# EasyEDA Pro project ProPrj_CraftVia-Station-S-v1-Rev0_2026-09-30.epro, schematic Schematic1, sheets 1 to 6 of 7

## Sheets
1 01_PWR_MEAS: Board Name: Board1; Create Date: 2026-09-15; Page Name: P1; Project Name: CraftVia-Station-S-v1-Rev0; Schematic Name: Schematic1; Update Date: 2026-09-15; Company: CraftVia.org; Page Size: A4; Version: V1.0
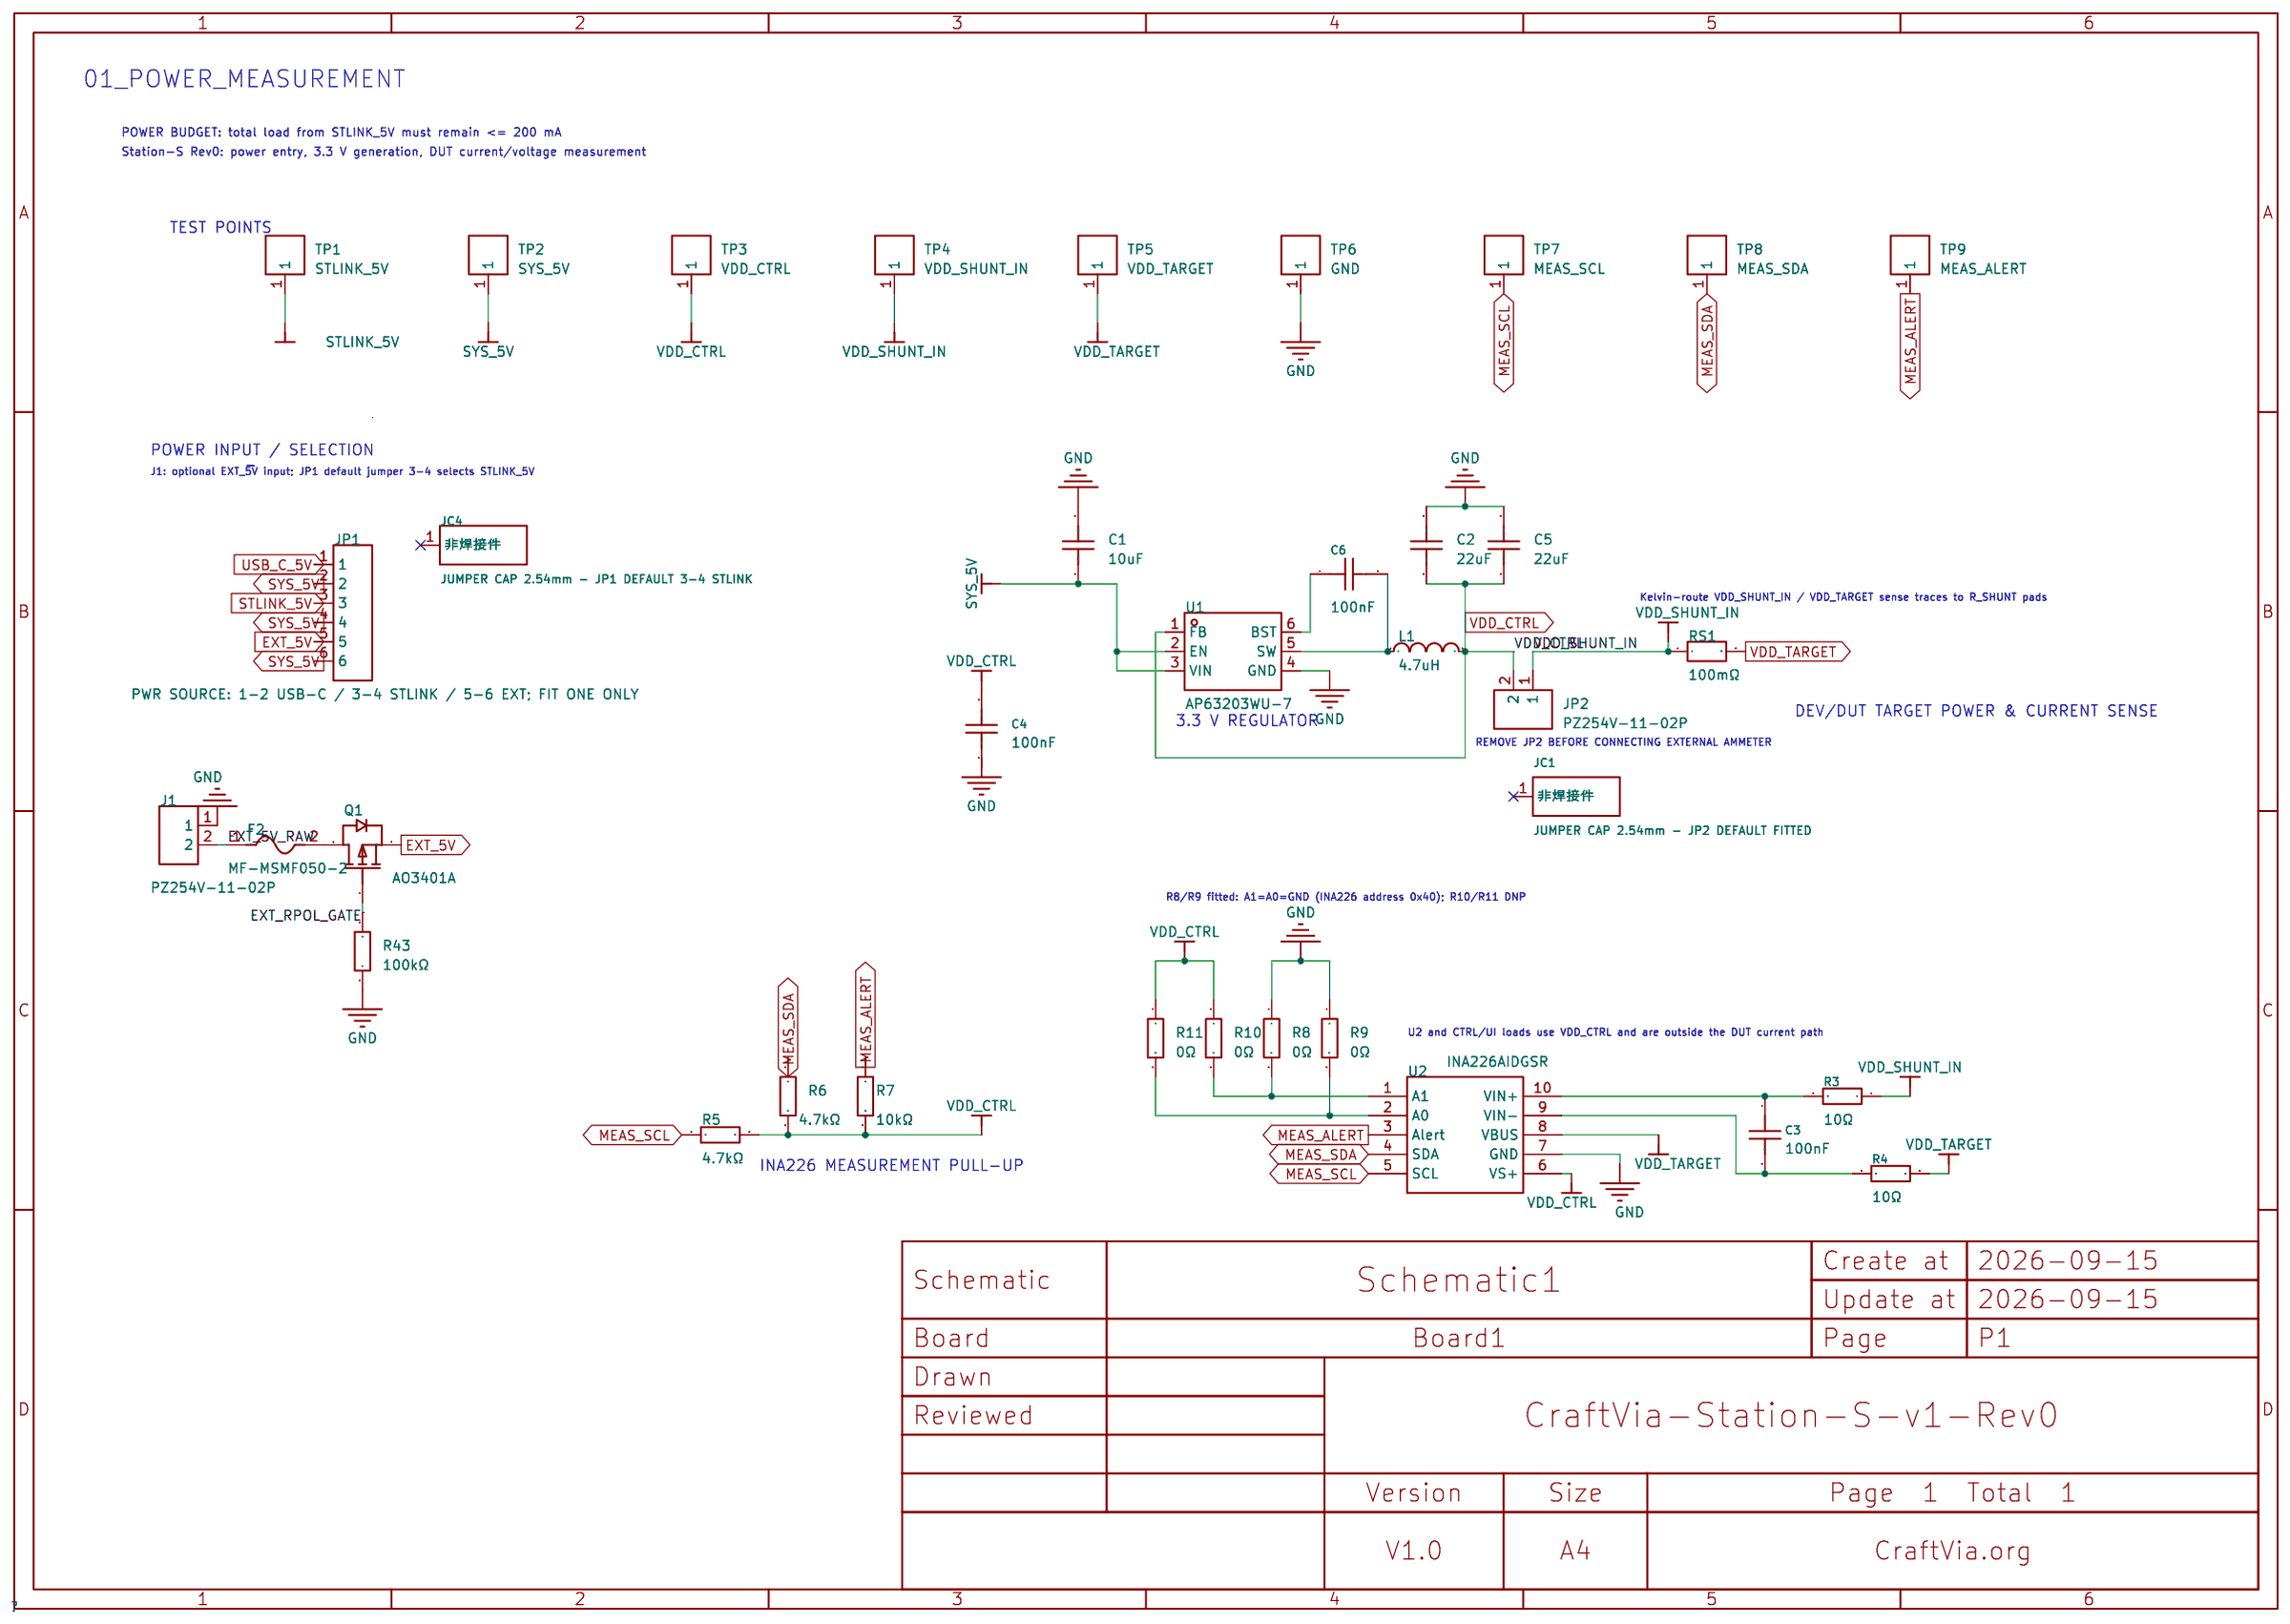
[diagram p0: 01_PWR_MEAS]
2 02_DEV_DEBUG
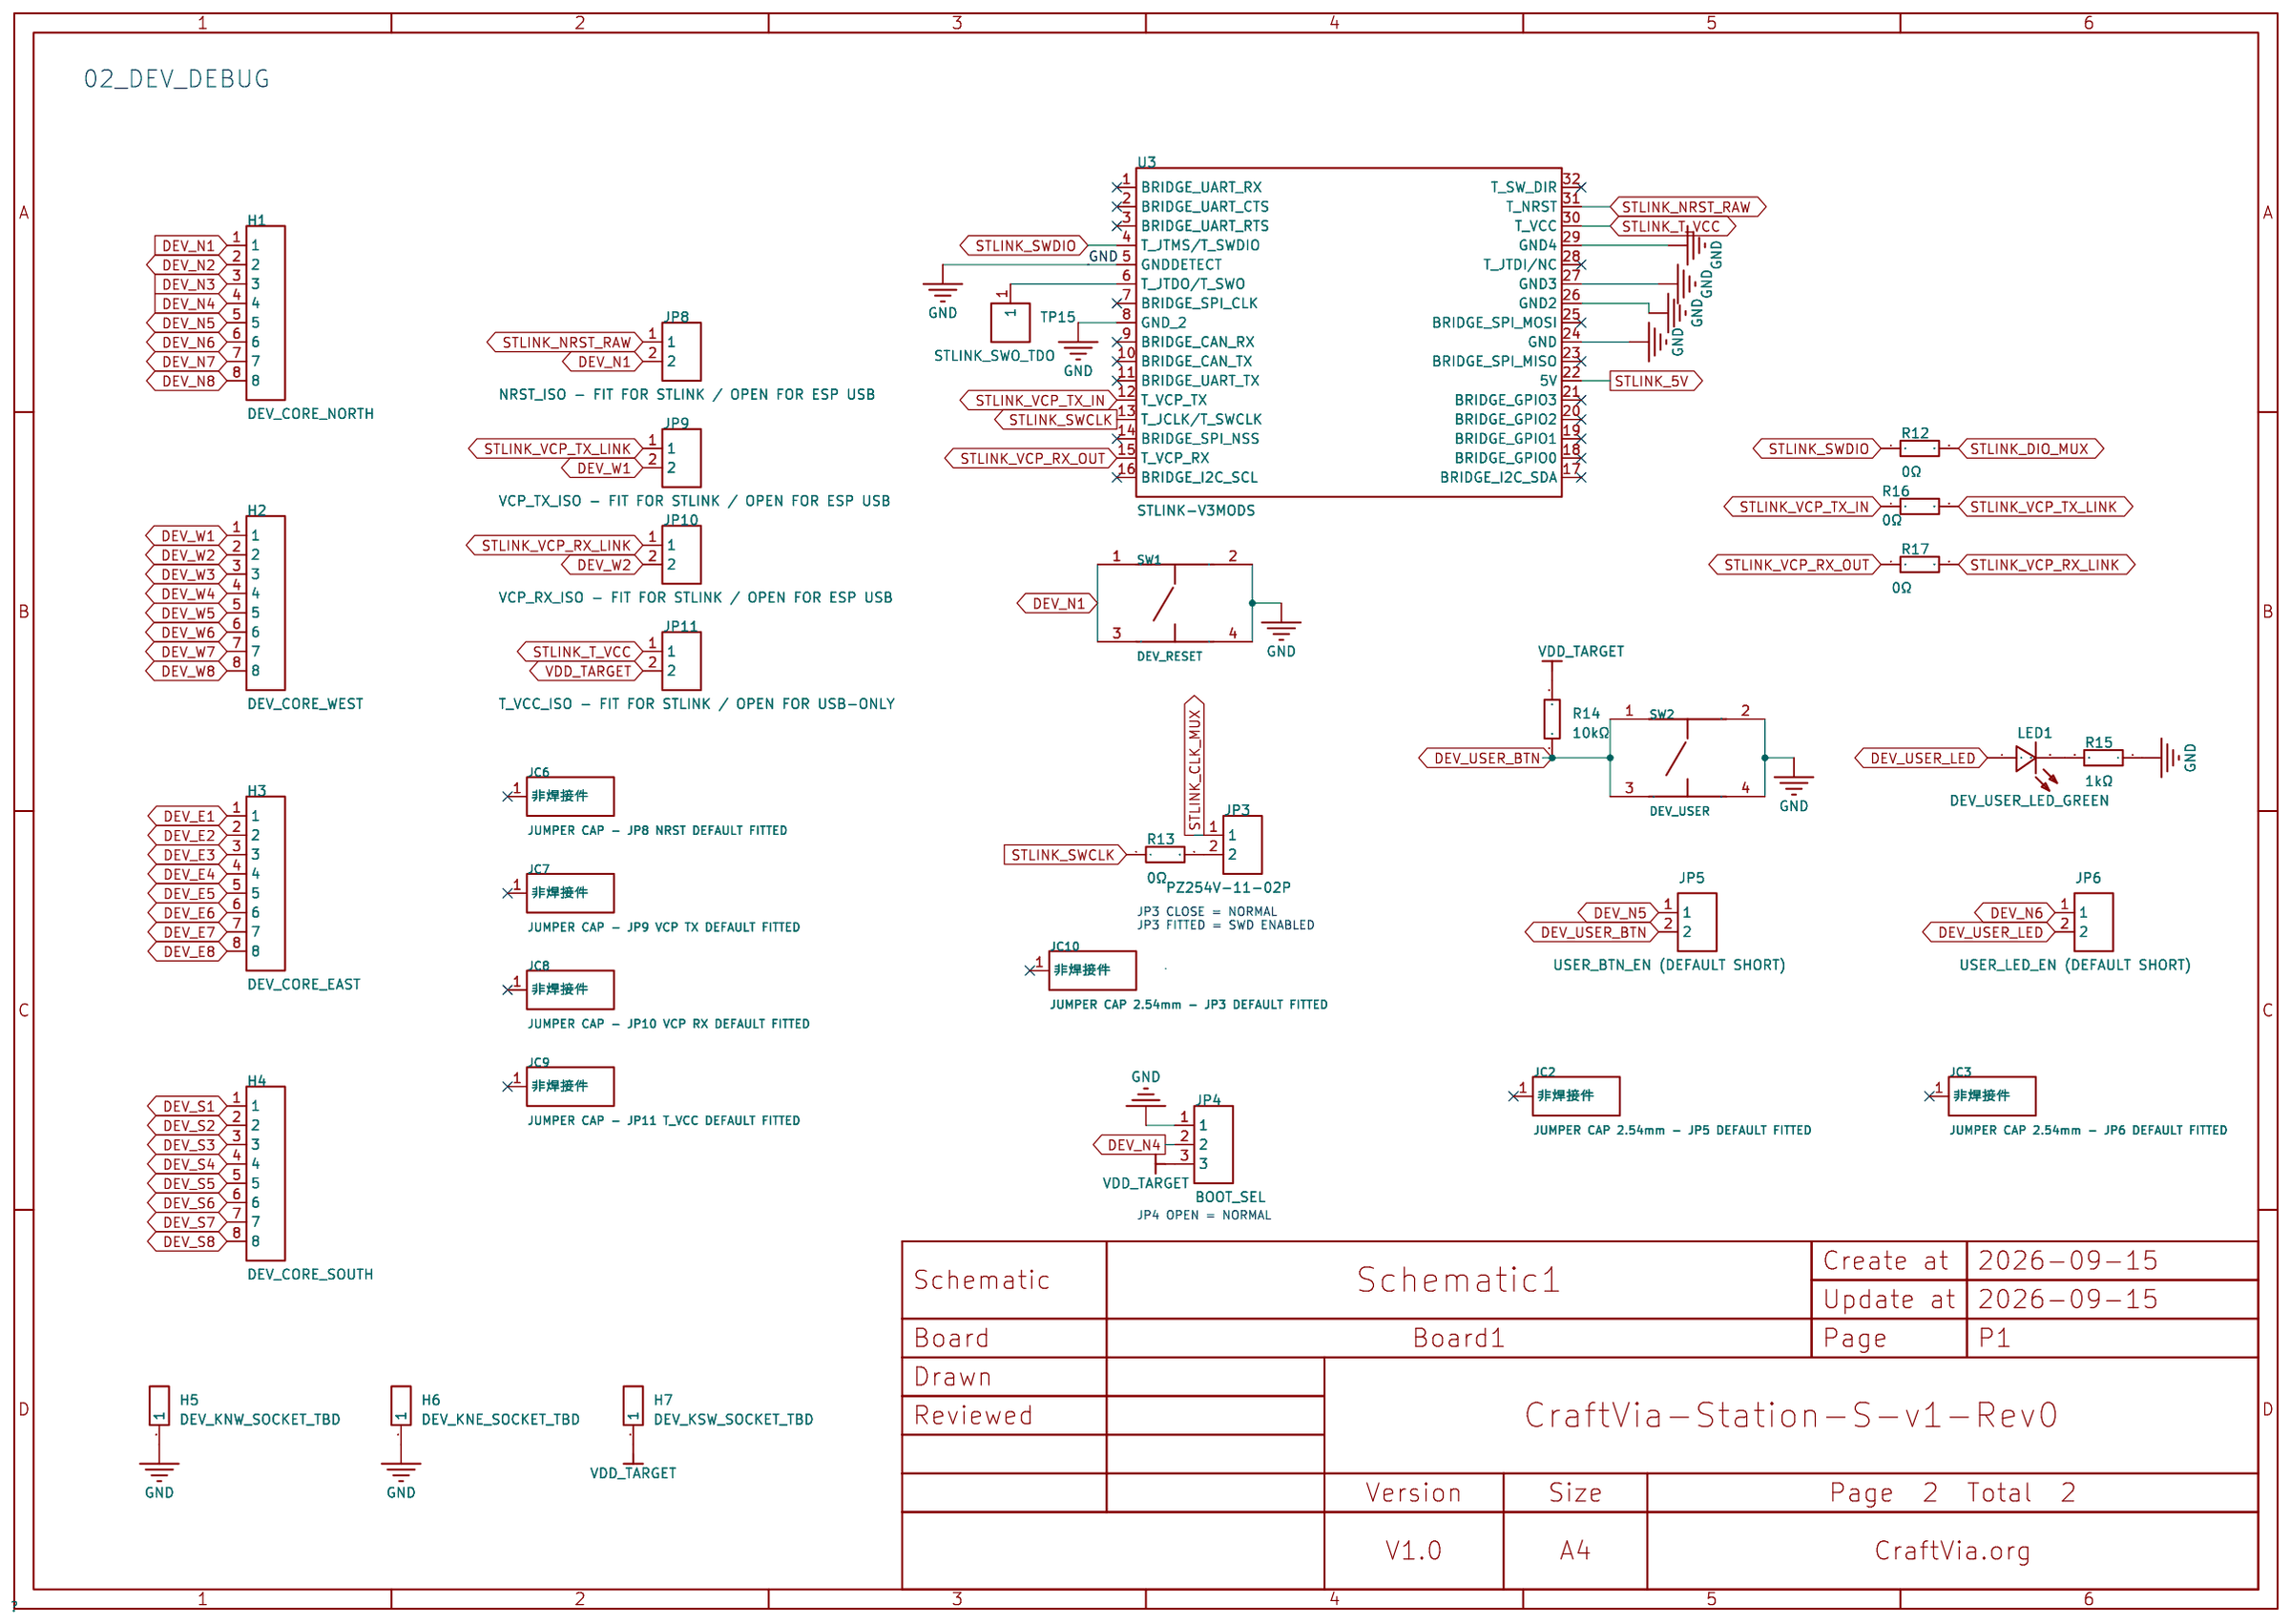
[diagram p1: 02_DEV_DEBUG]
3 03_GPIO_BREAKOUT: Create Date: 2026-09-16; Update Date: 2026-09-16
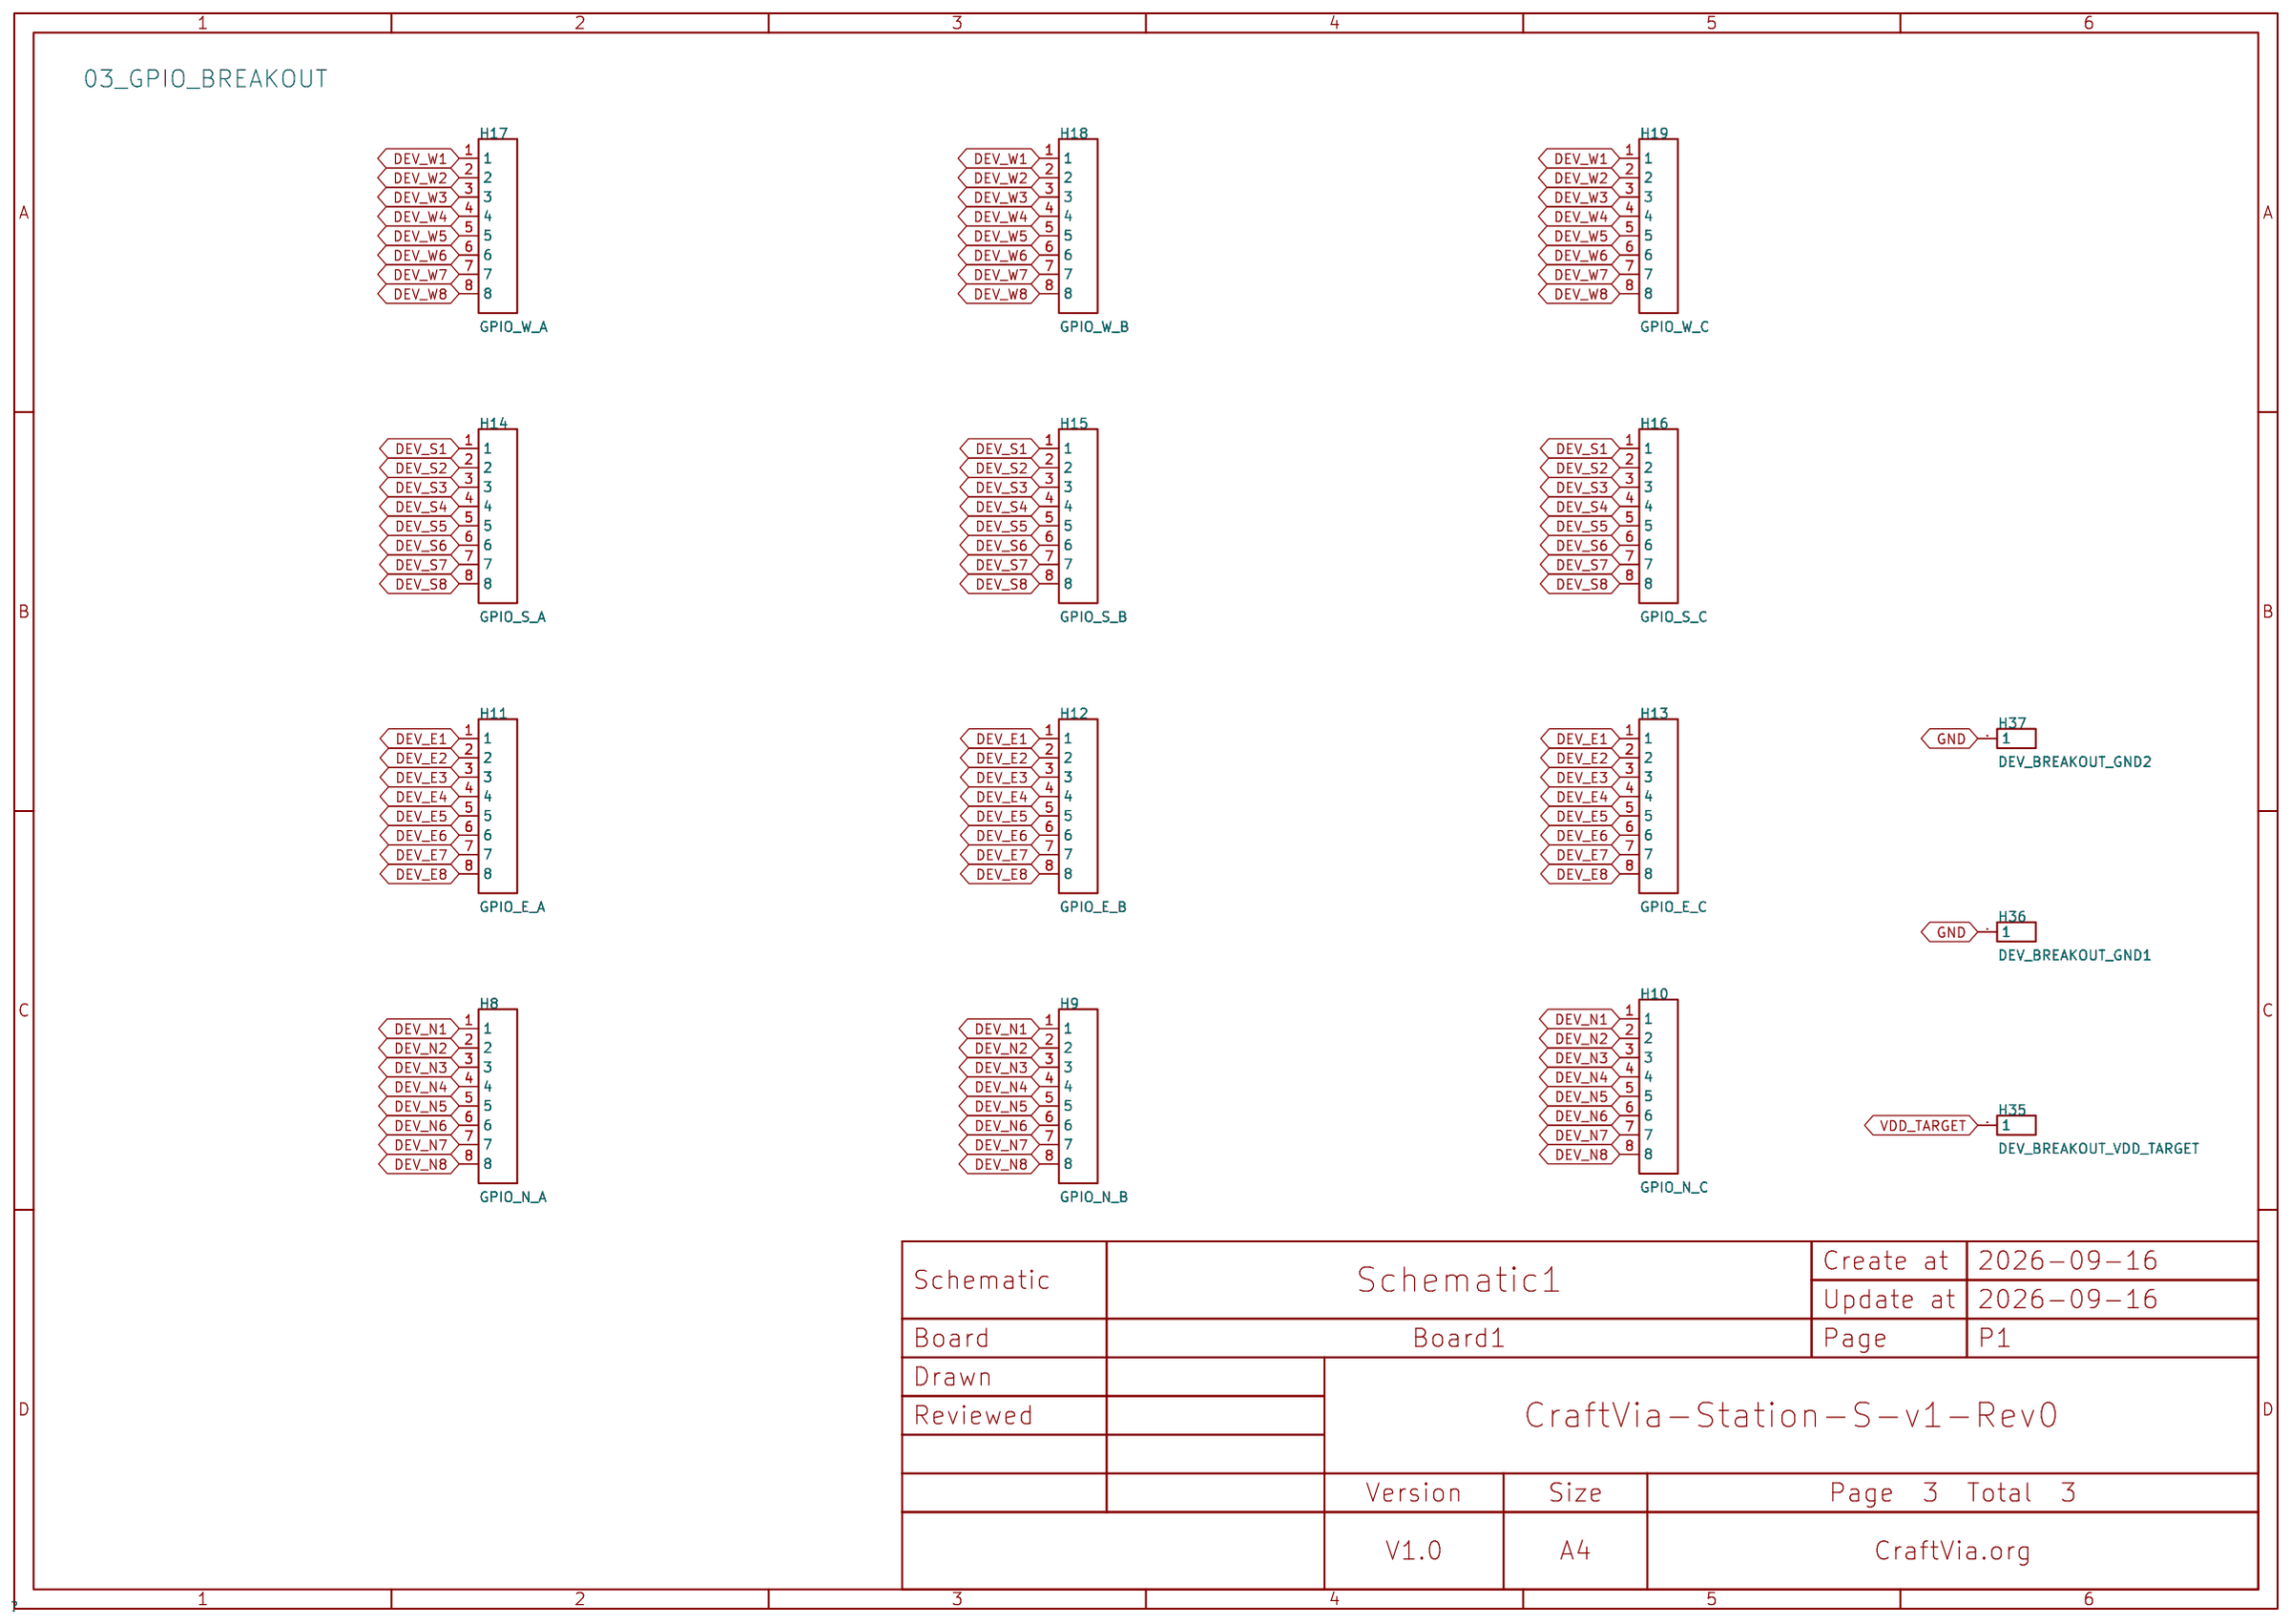
[diagram p2: 03_GPIO_BREAKOUT]
4 04_CTRL_CORE: Create Date: 2026-07-26; Page Name: P2; Project Name: 2026-07-26_USBAudio_CM108B_Proto; Update Date: 2026-07-26
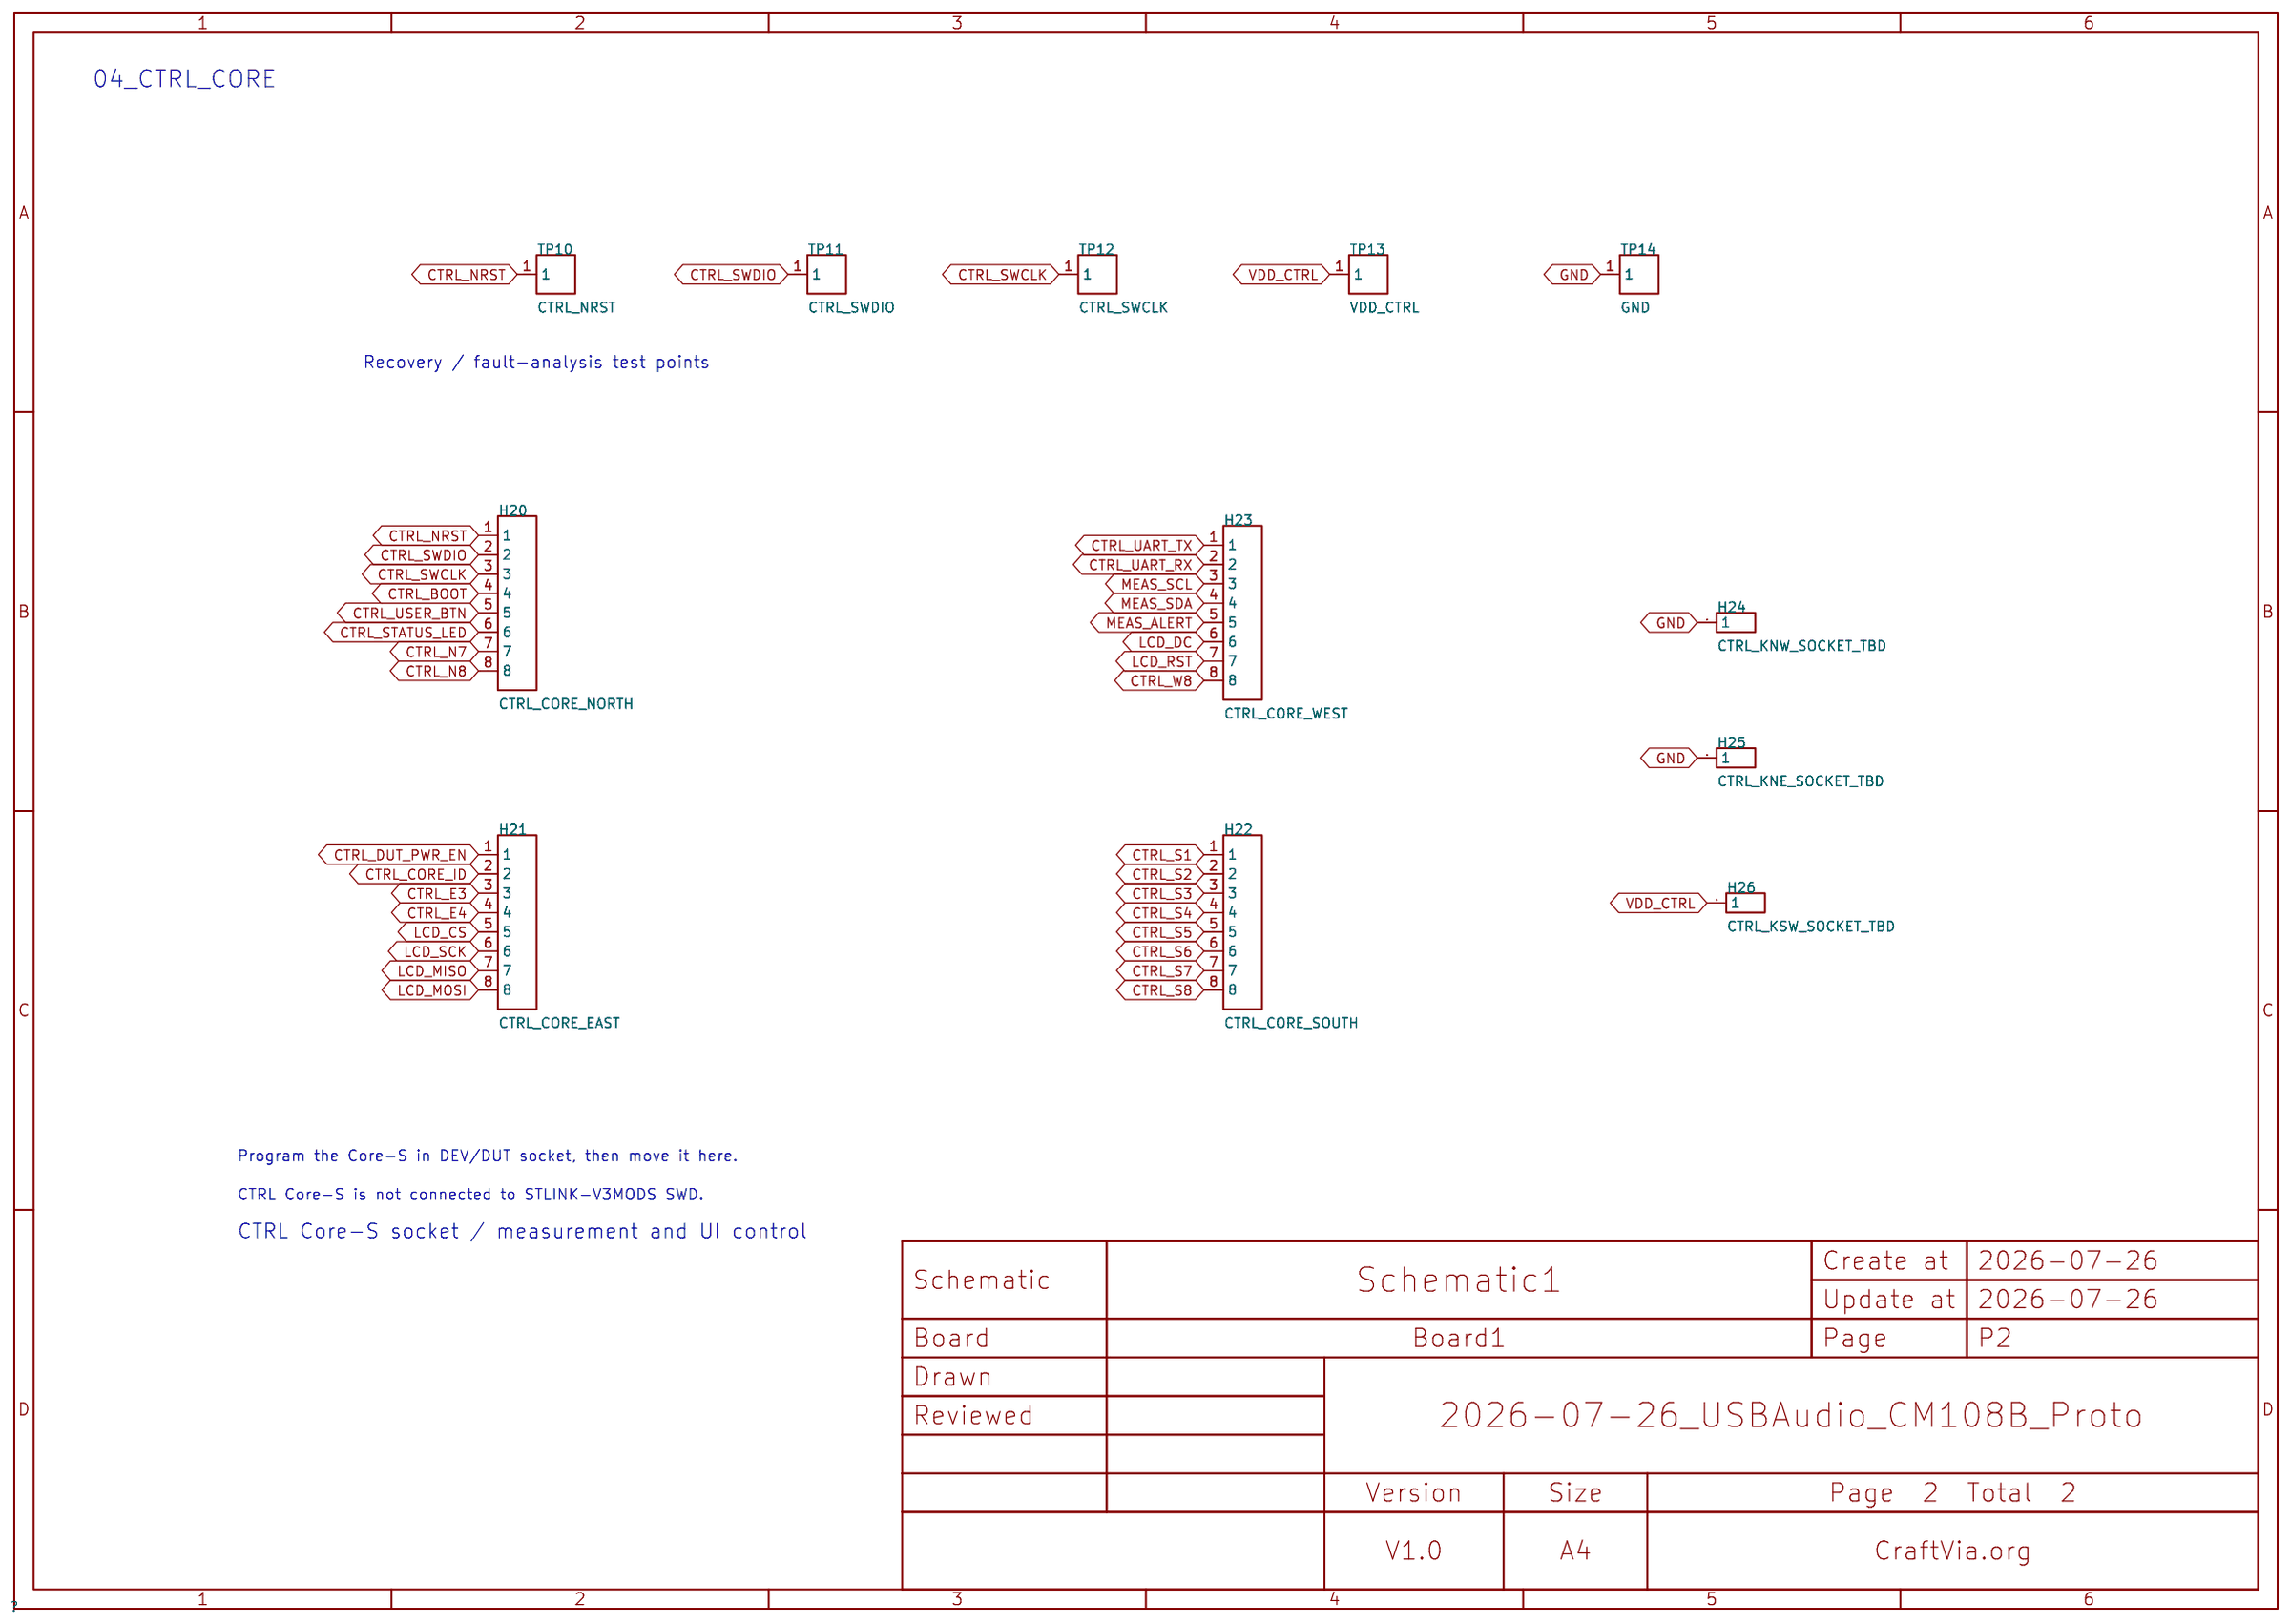
[diagram p3: 04_CTRL_CORE]
5 05_CTRL_UI: Create Date: 2026-09-16; Update Date: 2026-09-16
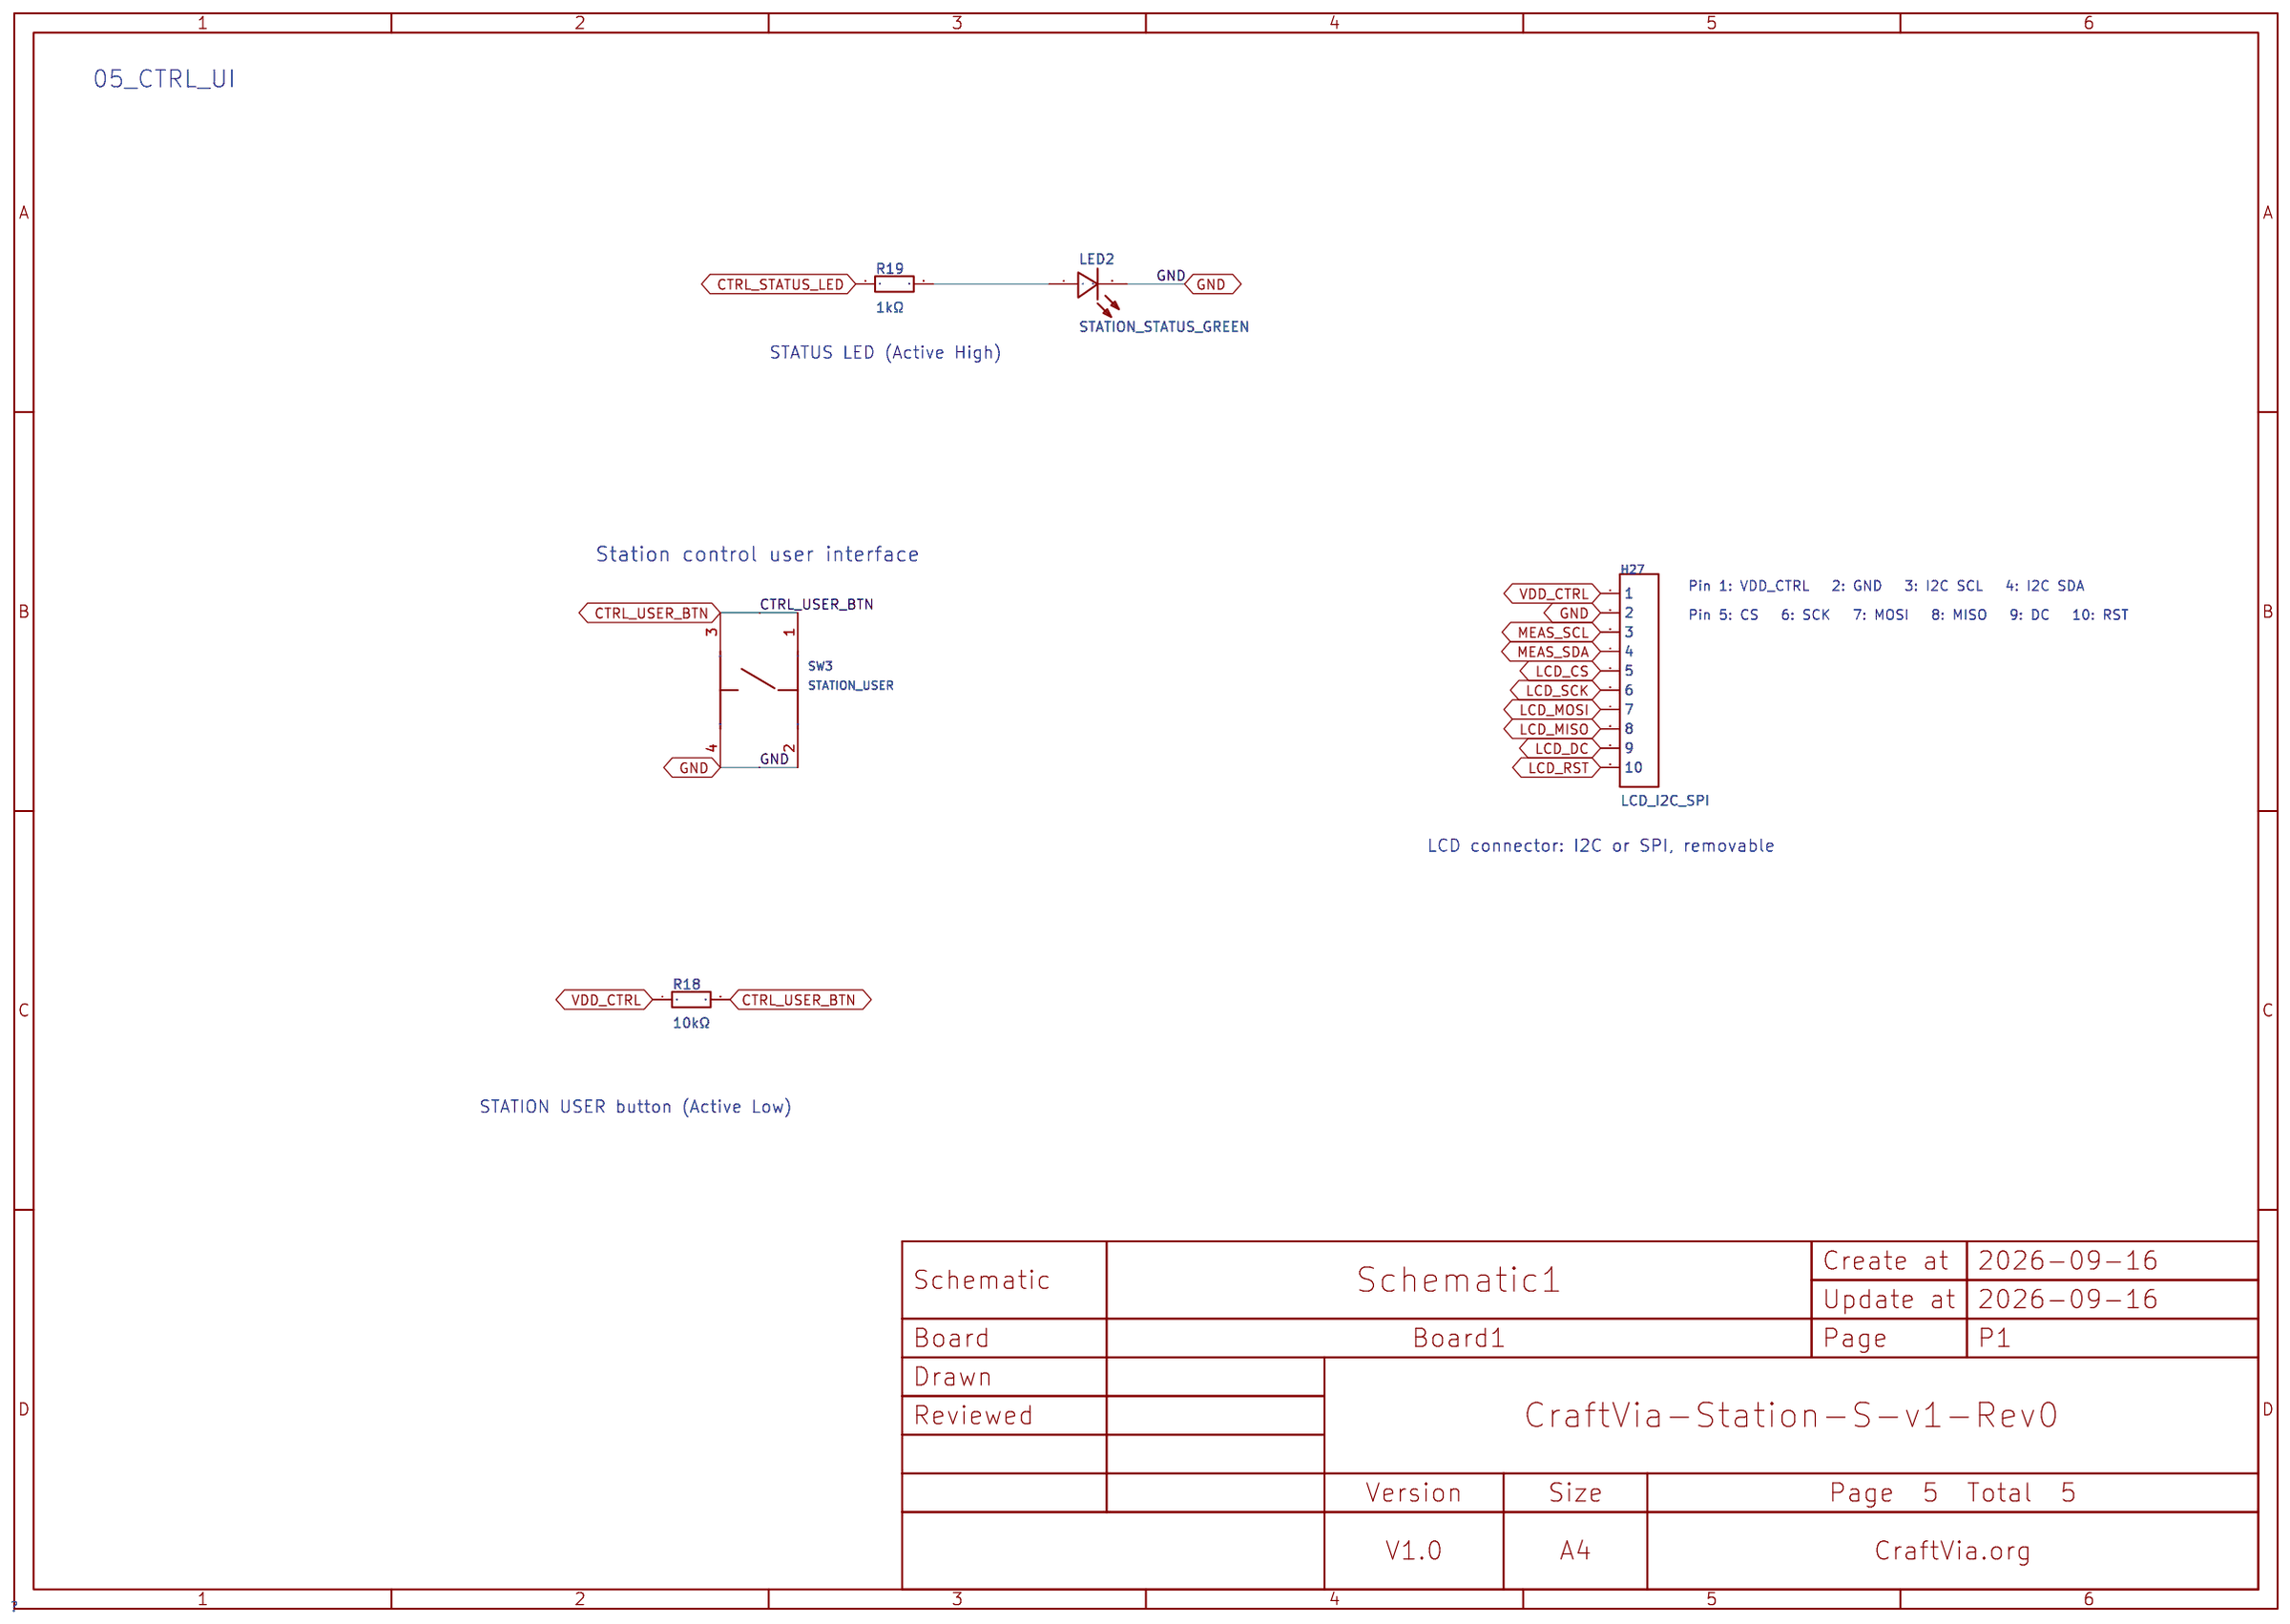
[diagram p4: 05_CTRL_UI]
6 06_CTRL_BREAKOUT: Create Date: 2026-09-16; Update Date: 2026-09-16
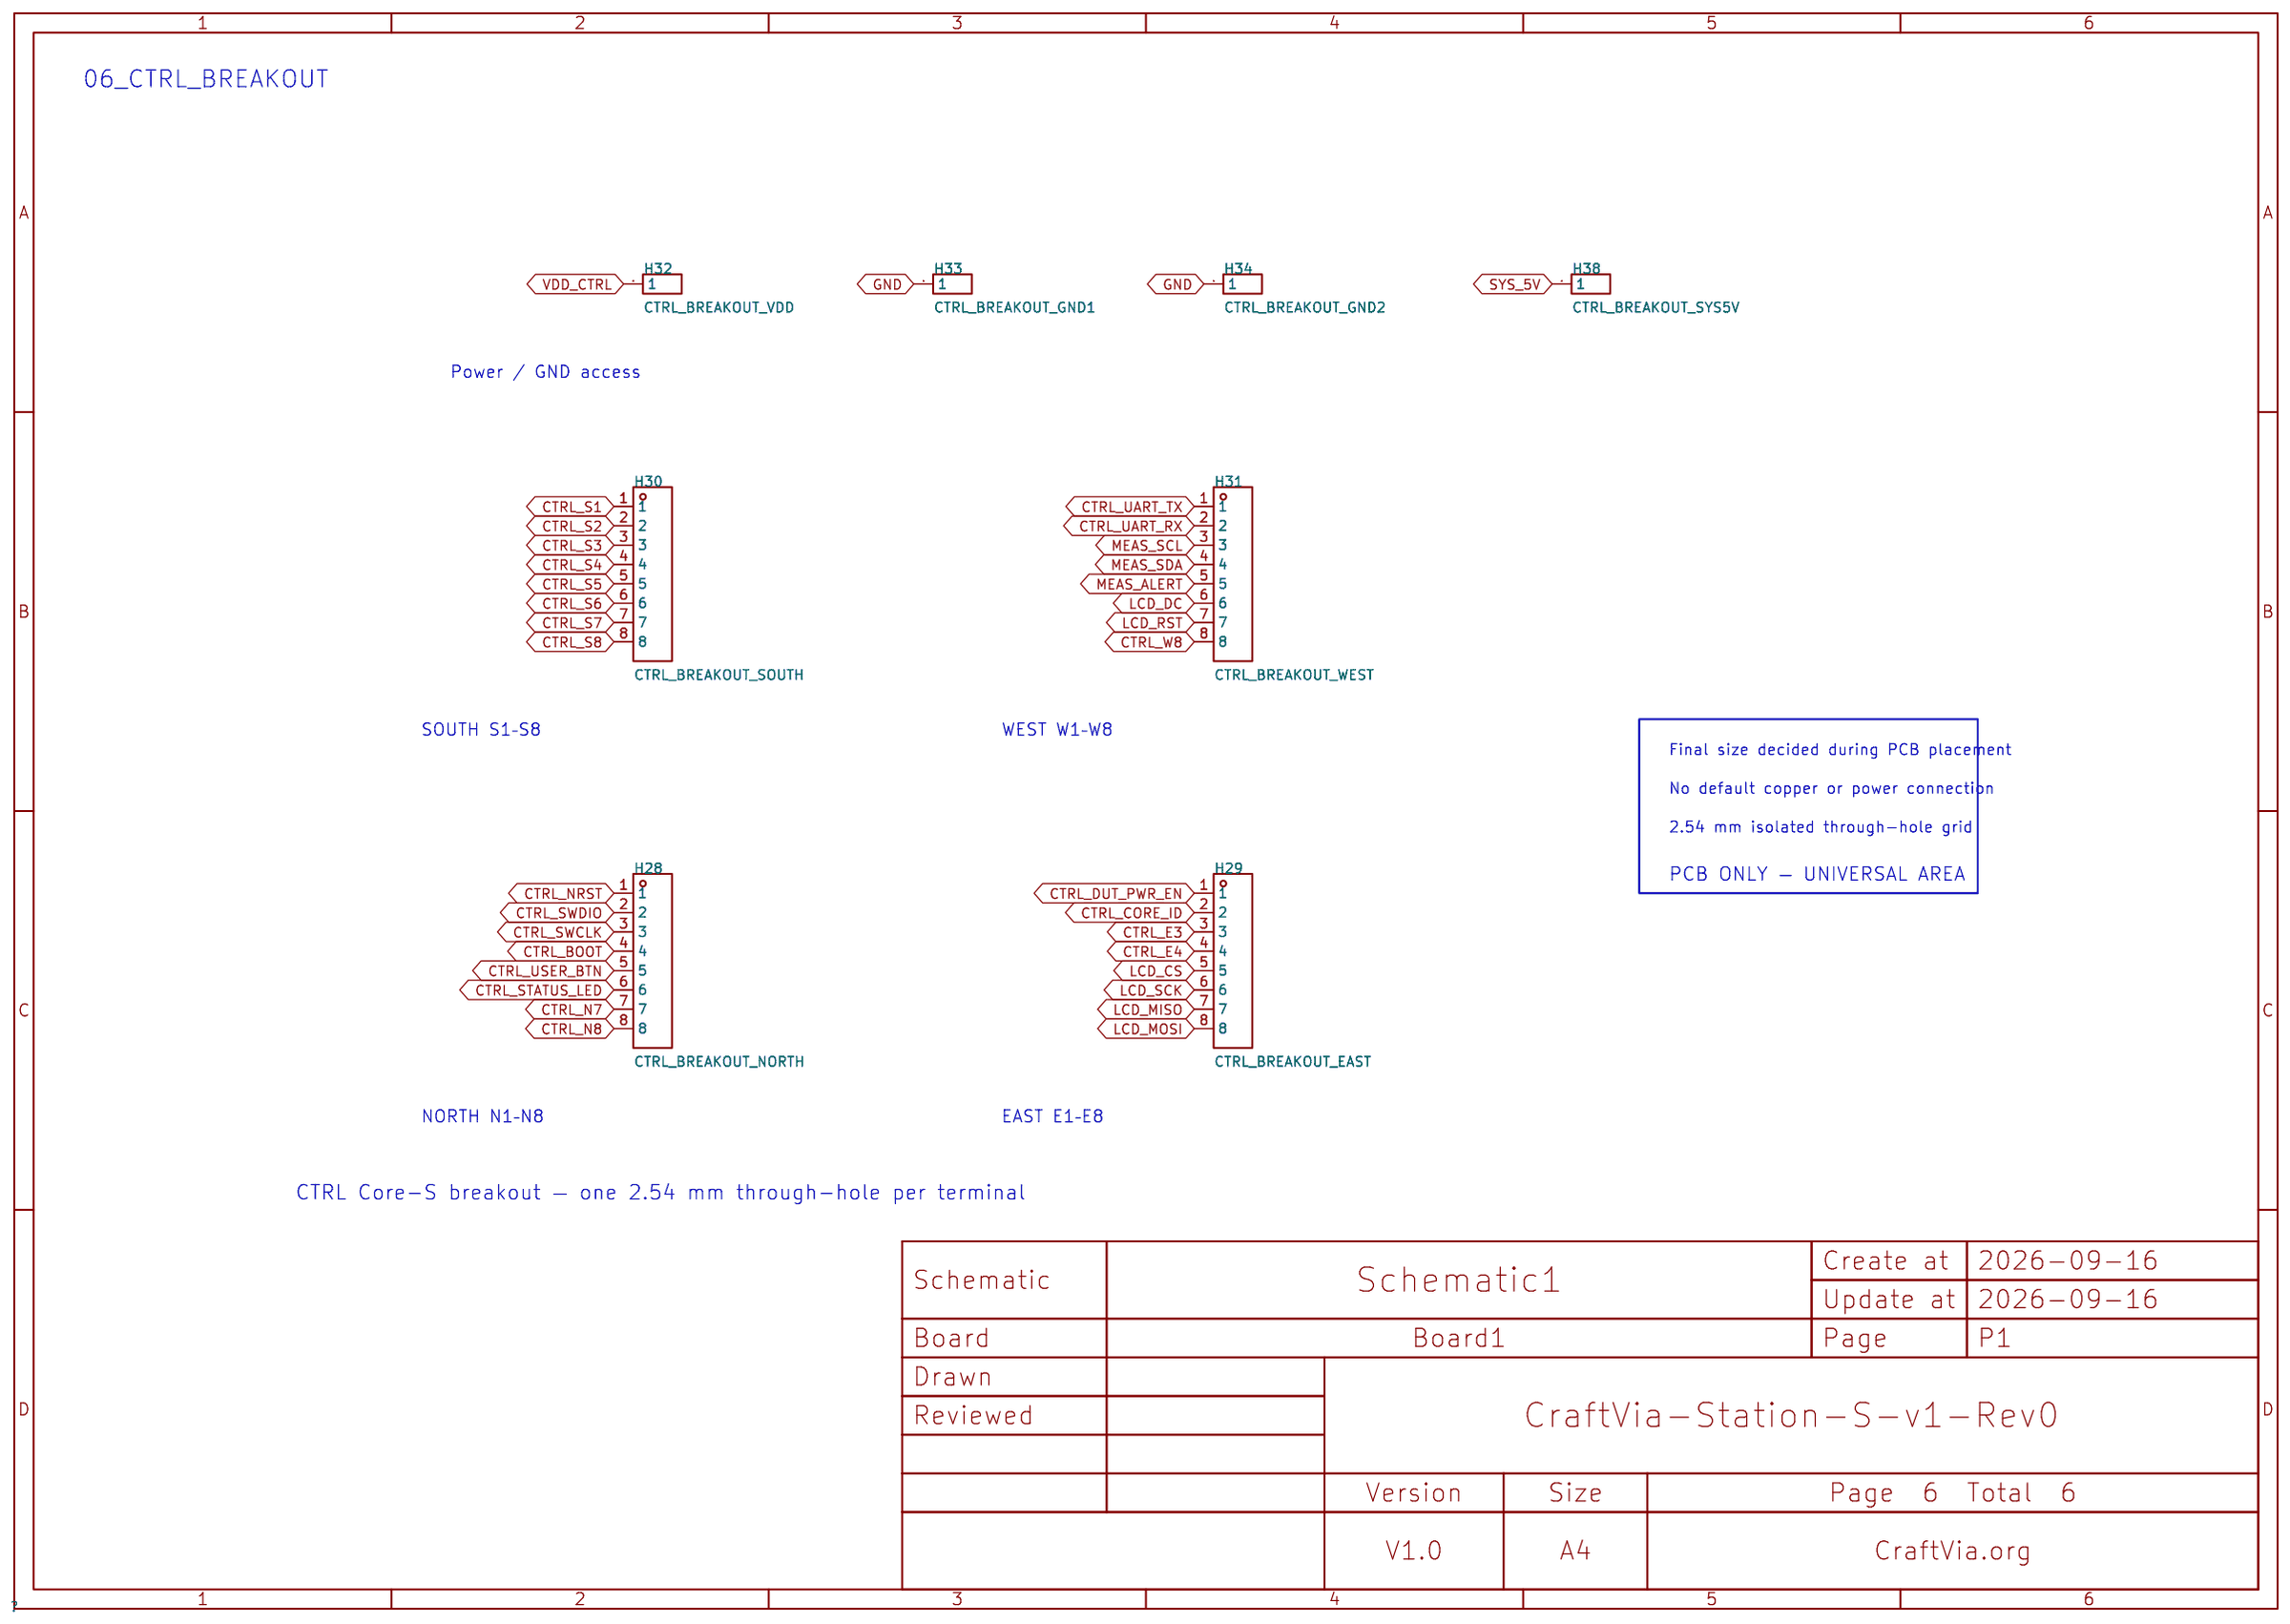
[diagram p5: 06_CTRL_BREAKOUT]

## Parts
sheet 01_PWR_MEAS
C1  10uF  [C0805]
C2  22uF  [C0805]
C3  100nF  [C0603]
C4  100nF  [C0603]
C5  22uF  [C0805]
C6  100nF  [C0603]
F2  MF-MSMF050-2  [F1812]
J1  PZ254V-11-02P  [HDR-TH_2P-P2.54-V-M]
JC1  JUMPER CAP 2.54mm - JP2 DEFAULT FITTED  [FL_001]
JC4  JUMPER CAP 2.54mm - JP1 DEFAULT 3-4 STLINK  [FL_001]
JP1  PWR SOURCE: 1-2 USB-C / 3-4 STLINK / 5-6 EXT; FIT ONE ONLY  [HDR-TH_6P-P2.54-V-M]
JP2  PZ254V-11-02P  [HDR-TH_2P-P2.54-V-M]
L1  4.7uH  [IND-SMD_L4.0-W4.0]
Q1  AO3401A  [SOT-23_L2.9-W1.3-P1.90-LS2.4-BR]
R3  10Ω  [R0603]
R4  10Ω  [R0603]
R5  4.7kΩ  [R0603]
R6  4.7kΩ  [R0603]
R7  10kΩ  [R0603]
R8  0Ω  [R0603]
R9  0Ω  [R0603]
R10  0Ω  [R0603]  (no BOM)
R11  0Ω  [R0603]  (no BOM)
R43  100kΩ  [R0603]
RS1  100mΩ  [R2512]
TP1  STLINK_5V  [CONN-SMD_5017]  (no BOM)
TP2  SYS_5V  [CONN-SMD_5017]  (no BOM)
TP3  VDD_CTRL  [CONN-SMD_5017]  (no BOM)
TP4  VDD_SHUNT_IN  [CONN-SMD_5017]  (no BOM)
TP5  VDD_TARGET  [CONN-SMD_5017]  (no BOM)
TP6  GND  [CONN-SMD_5017]  (no BOM)
TP7  MEAS_SCL  [CONN-SMD_5017]  (no BOM)
TP8  MEAS_SDA  [CONN-SMD_5017]  (no BOM)
TP9  MEAS_ALERT  [CONN-SMD_5017]  (no BOM)
U1  AP63203WU-7  [TSOT-26_L2.9-W1.6-P0.95-LS2.8-BL]
U2  INA226AIDGSR  [MSOP-10_L3.0-W3.0-P0.50-LS5.0-BL]
sheet 02_DEV_DEBUG
H1  DEV_CORE_NORTH  [HDR-TH_8P-P2.54-V-M]
H2  DEV_CORE_WEST  [HDR-TH_8P-P2.54-V-M]
H3  DEV_CORE_EAST  [HDR-TH_8P-P2.54-V-M]
H4  DEV_CORE_SOUTH  [HDR-TH_8P-P2.54-V-M]
H5  DEV_KNW_SOCKET_TBD  [HDR-TH_1P-P2.54-V-M]
H6  DEV_KNE_SOCKET_TBD  [HDR-TH_1P-P2.54-V-M]
H7  DEV_KSW_SOCKET_TBD  [HDR-TH_1P-P2.54-V-M]
JC2  JUMPER CAP 2.54mm - JP5 DEFAULT FITTED  [FL_001]
JC3  JUMPER CAP 2.54mm - JP6 DEFAULT FITTED  [FL_001]
JC6  JUMPER CAP - JP8 NRST DEFAULT FITTED  [FL_001]
JC7  JUMPER CAP - JP9 VCP TX DEFAULT FITTED  [FL_001]
JC8  JUMPER CAP - JP10 VCP RX DEFAULT FITTED  [FL_001]
JC9  JUMPER CAP - JP11 T_VCC DEFAULT FITTED  [FL_001]
JC10  JUMPER CAP 2.54mm - JP3 DEFAULT FITTED  [FL_001]
JP3  PZ254V-11-02P  [HDR-TH_2P-P2.54-V-M]
JP4  BOOT_SEL  [HDR-TH_3P-P2.54-V-M_PZ254V-11-03P]
JP5  USER_BTN_EN (DEFAULT SHORT)  [HDR-TH_2P-P2.54-V-M]
JP6  USER_LED_EN (DEFAULT SHORT)  [HDR-TH_2P-P2.54-V-M]
JP8  NRST_ISO - FIT FOR STLINK / OPEN FOR ESP USB  [HDR-TH_2P-P2.54-V-M]
JP9  VCP_TX_ISO - FIT FOR STLINK / OPEN FOR ESP USB  [HDR-TH_2P-P2.54-V-M]
JP10  VCP_RX_ISO - FIT FOR STLINK / OPEN FOR ESP USB  [HDR-TH_2P-P2.54-V-M]
JP11  T_VCC_ISO - FIT FOR STLINK / OPEN FOR USB-ONLY  [HDR-TH_2P-P2.54-V-M]
LED1  DEV_USER_LED_GREEN  [LED0805-R-RD]
R12  0Ω  [R0603]
R13  0Ω  [R0603]
R14  10kΩ  [R0402]
R15  1kΩ  [R0402]
R16  0Ω  [R0603]
R17  0Ω  [R0603]
SW1  DEV_RESET  [SW-SMD_4P-L6.4-W6.3-P4.00-LS9.5]
SW2  DEV_USER  [SW-SMD_4P-L6.4-W6.3-P4.00-LS9.5]
TP15  STLINK_SWO_TDO  [CONN-SMD_5017]  (no BOM)
U3  STLINK-V3MODS  [COMM-SMD_STLINK-V3MODS_1]
sheet 03_GPIO_BREAKOUT
H8  GPIO_N_A  [HDR-TH_8P-P2.54-V-F-1]  (no BOM)
H9  GPIO_N_B  [HDR-TH_8P-P2.54-V-F-1]  (no BOM)
H10  GPIO_N_C  [HDR-TH_8P-P2.54-V-F-1]  (no BOM)
H11  GPIO_E_A  [HDR-TH_8P-P2.54-V-F-1]  (no BOM)
H12  GPIO_E_B  [HDR-TH_8P-P2.54-V-F-1]  (no BOM)
H13  GPIO_E_C  [HDR-TH_8P-P2.54-V-F-1]  (no BOM)
H14  GPIO_S_A  [HDR-TH_8P-P2.54-V-F-1]  (no BOM)
H15  GPIO_S_B  [HDR-TH_8P-P2.54-V-F-1]  (no BOM)
H16  GPIO_S_C  [HDR-TH_8P-P2.54-V-F-1]  (no BOM)
H17  GPIO_W_A  [HDR-TH_8P-P2.54-V-F-1]  (no BOM)
H18  GPIO_W_B  [HDR-TH_8P-P2.54-V-F-1]  (no BOM)
H19  GPIO_W_C  [HDR-TH_8P-P2.54-V-F-1]  (no BOM)
H35  DEV_BREAKOUT_VDD_TARGET  [HDR-TH_1P-P2.54-V-M]
H36  DEV_BREAKOUT_GND1  [HDR-TH_1P-P2.54-V-M]
H37  DEV_BREAKOUT_GND2  [HDR-TH_1P-P2.54-V-M]
sheet 04_CTRL_CORE
H20  CTRL_CORE_NORTH  [HDR-TH_8P-P2.54-V-M]  (no BOM)
H21  CTRL_CORE_EAST  [HDR-TH_8P-P2.54-V-M]  (no BOM)
H22  CTRL_CORE_SOUTH  [HDR-TH_8P-P2.54-V-M]  (no BOM)
H23  CTRL_CORE_WEST  [HDR-TH_8P-P2.54-V-M]  (no BOM)
H24  CTRL_KNW_SOCKET_TBD  [HDR-TH_1P-P2.54-V-M]  (no BOM)
H25  CTRL_KNE_SOCKET_TBD  [HDR-TH_1P-P2.54-V-M]  (no BOM)
H26  CTRL_KSW_SOCKET_TBD  [HDR-TH_1P-P2.54-V-M]  (no BOM)
TP10  CTRL_NRST  [CONN-SMD_5017]  (no BOM)
TP11  CTRL_SWDIO  [CONN-SMD_5017]  (no BOM)
TP12  CTRL_SWCLK  [CONN-SMD_5017]  (no BOM)
TP13  VDD_CTRL  [CONN-SMD_5017]  (no BOM)
TP14  GND  [CONN-SMD_5017]  (no BOM)
sheet 05_CTRL_UI
H27  LCD_I2C_SPI  [HDR-TH_10P-P2.54-V-F]  (no BOM)
LED2  STATION_STATUS_GREEN  [LED0805-R-RD]
R18  10kΩ  [R0603]
R19  1kΩ  [R0603]
SW3  STATION_USER  [SW-SMD_4P-L6.4-W6.3-P4.00-LS9.5]
sheet 06_CTRL_BREAKOUT
H28  CTRL_BREAKOUT_NORTH  [HDR-TH_8P-P2.54-V-M]  (no BOM)
H29  CTRL_BREAKOUT_EAST  [HDR-TH_8P-P2.54-V-M]  (no BOM)
H30  CTRL_BREAKOUT_SOUTH  [HDR-TH_8P-P2.54-V-M]  (no BOM)
H31  CTRL_BREAKOUT_WEST  [HDR-TH_8P-P2.54-V-M]  (no BOM)
H32  CTRL_BREAKOUT_VDD  [HDR-TH_1P-P2.54-V-M]  (no BOM)
H33  CTRL_BREAKOUT_GND1  [HDR-TH_1P-P2.54-V-M]  (no BOM)
H34  CTRL_BREAKOUT_GND2  [HDR-TH_1P-P2.54-V-M]  (no BOM)
H38  CTRL_BREAKOUT_SYS5V  [HDR-TH_1P-P2.54-V-M]  (no BOM)

## Library data of the parts
C1 = CL21A106KAYNNNE_C15850: Capacitance:10uF Tolerance:±10% Tolerance:±10% Voltage Rating:25V Temperature Coefficient:X5R; LCSC Part Name: 10uF ±10% 25V; Supplier Part: CL21A106KAYNNNE.1; Manufacturer: SAMSUNG(三星); Manufacturer Part: CL21A106KAYNNNE; Supplier Footprint: 0805; JLCPCB Part Class: Basic Part; Datasheet: https://item.szlcsc.com/datasheet/CL21A106KAYNNNE/16532.html; Supplier: LCSC; Tolerance: ±10%; Voltage Rating: 25V; Temperature Coefficient: X5R
C2 C5 = CL21A226MAQNNNE: Capacitance:22uF Tolerance:±20% Tolerance:±20% Voltage Rating:25V Temperature Coefficient:X5R; LCSC Part Name: 22uF ±20% 25V; Supplier Part: CL21A226MAQNNNE.1; Manufacturer: SAMSUNG(三星); Supplier Footprint: 0805; JLCPCB Part Class: Basic Part; Datasheet: https://item.szlcsc.com/datasheet/CL21A226MAQNNNE/46786.html; Supplier: LCSC; Tolerance: ±20%; Voltage Rating: 25V; Temperature Coefficient: X5R
C3 C4 = CL10B104KB8NNNC: Capacitance:100nF Tolerance:±10% Tolerance:±10% Voltage Rating:50V Temperature Coefficient:X7R; LCSC Part Name: 100nF ±10% 50V; Supplier Part: C1591; Manufacturer: SAMSUNG(三星); Supplier Footprint: 0603; JLCPCB Part Class: Extended Part; Datasheet: https://item.szlcsc.com/datasheet/CL10B104KB8NNNC/1943.html; Supplier: LCSC; Tolerance: ±10%; Voltage Rating: 50V; Temperature Coefficient: X7R
C6 = CL10B104KB8NNNC: Capacitance:100nF Tolerance:±10% Tolerance:±10% Voltage Rating:50V Temperature Coefficient:X7R; LCSC Part Name: 100nF ±10% 50V; Supplier Part: CL10B104KB8NNNC.1; Manufacturer: SAMSUNG(三星); Supplier Footprint: 0603; JLCPCB Part Class: Extended Part; Datasheet: https://item.szlcsc.com/datasheet/CL10B104KB8NNNC/1943.html; Supplier: LCSC; Tolerance: ±10%; Voltage Rating: 50V; Temperature Coefficient: X7R
F2 = MF-MSMF050-2: Voltage - Max:15V Current - Max:100A Hold Current:500mA Trip Current:1A Power Dissipation:800mW Resistance - Initial (Ri) (Min):150mΩ Resistance - Post Trip (R1) (Max):1Ω Time to Trip(Max):150ms Operating Temperature:-40℃~+85℃ Operating Temperature:-40℃~+; LCSC Part Name: 15V 500mA 1812自恢复; Supplier Part: C17313; Manufacturer: BOURNS; Supplier Footprint: 1812; JLCPCB Part Class: Extended Part; Datasheet: https://item.szlcsc.com/datasheet/MF-MSMF050-2/17998.html; Supplier: LCSC; Voltage - Max: 15V; Current - Max: 100A; Hold Current: 500mA; Trip Current: 1A; Power Dissipation: 800mW; Resistance - Initial (Ri) (Min): 150mΩ; Resistance - Post Trip (R1) (Max): 1Ω; Time to Trip(Max): 150ms; Operating Temperature: -40℃~+85℃; Length: 5.4mm; Width: 3.2mm; Height: 0.85mm
J1 JP2 JP8-JP10 = PZ254V-11-02P: Pin Structure:1x2P Pitch:2.54mm Row Spacing:- Circluar Pins/Square Pins:Square pin Mounting Type:Through Hole Number of Rows:1 Number of Pins:2P Current Rating:3A Voltage Rating (Max):250V Length of Mating Pin:6.1mm Insulation Height:2.5mm Length of End C; LCSC Part Name: 1x2P 间距:2.54mm 方针 直插; Supplier Part: C492401; Manufacturer: XFCN(兴飞); Supplier Footprint: 插件,P=2.54mm; JLCPCB Part Class: Extended Part; Datasheet: https://item.szlcsc.com/datasheet/PZ254V-11-02P/502957.html; Supplier: LCSC; Pin Structure: 1x2P; Pitch: 2.54mm; Circluar Pins/Square Pins: Square pin; Mounting Type: Through Hole; Number of Rows: 1; Number of Pins: 2P; Current Rating: 3A; Voltage Rating (Max): 250V; Length of Mating Pin: 6.1mm; Insulation Height: 2.5mm; Length of End Connection Pin: 3mm; Contact Material: Brass; Contact Plating: Gold; Operating Temperature: -40℃~+105℃; Color: Black
JC1 = 2.54短路帽开口: Number of Positions or Pins:1x2 Pitch:2.54mm Open Top/Close Top:Open-Top Current Rating:3A colour:Black Long Handle or Not:Unshrouded; LCSC Part Name: 2.54mm 开顶式; Supplier Part: C5305; Manufacturer: BOOMELE(博穆精密); Supplier Footprint: P=2.54mm; JLCPCB Part Class: Extended Part; Datasheet: https://item.szlcsc.com/datasheet/2.54%25E7%259F%25AD%25E8%25B7%25AF%25E5%25B8%25BD%25E5%25BC%2580%25E5%258F%25A3/5732.html; Supplier: LCSC; Number of Positions or Pins: 1x2; Pitch: 2.54mm; Open Top/Close Top: Open-Top; Current Rating: 3A; colour: Black; Long Handle or Not: Unshrouded
JC4 JC6-JC9 = 2.54短路帽开口: Number of Positions or Pins:1x2 Pitch:2.54mm Open Top/Close Top:Open-Top Current Rating:3A colour:Black Long Handle or Not:Unshrouded; LCSC Part Name: 2.54mm 开顶式; Supplier Part: 2.54短路帽开口.1; Manufacturer: BOOMELE(博穆精密); Supplier Footprint: P=2.54mm; JLCPCB Part Class: Extended Part; Datasheet: https://item.szlcsc.com/datasheet/2.54%25E7%259F%25AD%25E8%25B7%25AF%25E5%25B8%25BD%25E5%25BC%2580%25E5%258F%25A3/5732.html; Supplier: LCSC; Number of Positions or Pins: 1x2; Pitch: 2.54mm; Open Top/Close Top: Open-Top; Current Rating: 3A; colour: Black; Long Handle or Not: Unshrouded
JP1 = PZ254V-11-06P: Pin Structure:1x6P Pitch:2.54mm Row Spacing:- Circluar Pins/Square Pins:Square pin Mounting Type:Through Hole Number of Rows:1 Number of Pins:6P Current Rating:3A Voltage Rating (Max):250V Length of Mating Pin:6.1mm Insulation Height:2.5mm Length of End C; LCSC Part Name: 1x6P 间距:2.54mm 方针 直插; Supplier Part: PZ254V-11-06P.1; Manufacturer: XFCN(兴飞); Supplier Footprint: 插件,P=2.54mm; JLCPCB Part Class: Extended Part; Datasheet: https://item.szlcsc.com/datasheet/PZ254V-11-06P/502961.html; Supplier: LCSC; Pin Structure: 1x6P; Pitch: 2.54mm; Circluar Pins/Square Pins: Square pin; Mounting Type: Through Hole; Number of Rows: 1; Number of Pins: 6P; Current Rating: 3A; Voltage Rating (Max): 250V; Length of Mating Pin: 6.1mm; Insulation Height: 2.5mm; Length of End Connection Pin: 3mm; Contact Material: Brass; Contact Plating: Gold; Operating Temperature: -40℃~+105℃; Color: Black
L1 = SWPA4030S4R7MT: Inductance:4.7uH Tolerance:±20% Tolerance:±20% Current Rating:2A Current - Saturation(Isat):3.2A DC Resistance(DCR):78mΩ Type:- Ratings:-; LCSC Part Name: 4.7uH ±20% 3.2A; Supplier Part: SWPA4030S4R7MT.1; Manufacturer: Sunlord(顺络); Supplier Footprint: SMD,4x4mm; JLCPCB Part Class: Extended Part; Datasheet: https://item.szlcsc.com/datasheet/SWPA4030S4R7MT/58303.html; Supplier: LCSC; Tolerance: ±20%; Current Rating: 2A; Current - Saturation(Isat): 3.2A; DC Resistance(DCR): 78mΩ
Q1 = AO3401A_C15127: Number:1 P-Channel Drain to Source Voltage:30V Current - Continuous Drain(Id):4A RDS(on):47mΩ@10V；85mΩ@2.5V；60mΩ@4.5V Pd - Power Dissipation:- Gate Threshold Voltage (Vgs(th)):900mV Gate Charge(Qg):14nC@10V Input Capacitance(Ciss):645pF Reverse Transfer C; LCSC Part Name: 1个P沟道 耐压:30V 电流:4A; Supplier Part: C15127; Manufacturer: AOS; Supplier Footprint: SOT-23; JLCPCB Part Class: Basic Part; Datasheet: https://item.szlcsc.com/datasheet/AO3401A/15801.html; Supplier: LCSC; Number: 1 P-Channel; Drain to Source Voltage: 30V; Current - Continuous Drain(Id): 4A; RDS(on): 47mΩ@10V；85mΩ@2.5V；60mΩ@4.5V; Gate Threshold Voltage (Vgs(th)): 900mV; Gate Charge(Qg): 14nC@10V; Input Capacitance(Ciss): 645pF; Reverse Transfer Capacitance (Crss@Vds): 55pF; Output Capacitance(Coss): 80pF
R3 R4 = 0603WAF100JT5E: Type:Thick Film Resistor Resistance:10Ω Tolerance:±1% Tolerance:±1% Power(Watts):100mW Voltage-Supply(Max):75V Temperature Coefficient:±400ppm/℃ Temperature Coefficient:±400ppm/℃ Operating Temperature:-55℃~+155℃ Operating Temperature:-55℃~+155℃; LCSC Part Name: 10Ω ±1% 100mW 厚膜电阻; Supplier Part: C22859; Manufacturer: UNI-ROYAL(厚声); Supplier Footprint: 0603; JLCPCB Part Class: Basic Part; Datasheet: https://item.szlcsc.com/datasheet/0603WAF100JT5E/23586.html; Supplier: LCSC; Type: Thick Film Resistor; Tolerance: ±1%; Power(Watts): 100mW; Voltage-Supply(Max): 75V; Temperature Coefficient: ±400ppm/℃; Operating Temperature: -55℃~+155℃
R5 R6 = 0603WAF4701T5E: Type:Thick Film Resistor Resistance:4.7kΩ Tolerance:±1% Tolerance:±1% Power(Watts):100mW Voltage-Supply(Max):75V Temperature Coefficient:±100ppm/℃ Temperature Coefficient:±100ppm/℃ Operating Temperature:-55℃~+155℃ Operating Temperature:-55℃~+155℃; LCSC Part Name: 厚膜电阻 4.7kΩ ±1%; Supplier Part: C23162; Manufacturer: UNI-ROYAL(厚声); Supplier Footprint: 0603; JLCPCB Part Class: Basic Part; Datasheet: https://item.szlcsc.com/datasheet/0603WAF4701T5E/23889.html; Supplier: LCSC; Type: Thick Film Resistor; Tolerance: ±1%; Power(Watts): 100mW; Voltage-Supply(Max): 75V; Temperature Coefficient: ±100ppm/℃; Operating Temperature: -55℃~+155℃
R7 R18 = 0603WAF1002T5E: Type:Thick Film Resistor Resistance:10kΩ Tolerance:±1% Tolerance:±1% Power(Watts):100mW Voltage-Supply(Max):75V Temperature Coefficient:±100ppm/℃ Temperature Coefficient:±100ppm/℃ Operating Temperature:-55℃~+155℃ Operating Temperature:-55℃~+155℃; LCSC Part Name: 厚膜电阻 10kΩ ±1% 100mW; Supplier Part: C25804; Manufacturer: UNI-ROYAL(厚声); Supplier Footprint: 0603; JLCPCB Part Class: Basic Part; Datasheet: https://item.szlcsc.com/datasheet/0603WAF1002T5E/26547.html; Supplier: LCSC; Type: Thick Film Resistor; Tolerance: ±1%; Power(Watts): 100mW; Voltage-Supply(Max): 75V; Temperature Coefficient: ±100ppm/℃; Operating Temperature: -55℃~+155℃
R8-R11 = 0603WAF0000T5E: Type:Thick Film Resistor Resistance:0Ω Tolerance:±1% Tolerance:±1% Power(Watts):100mW Voltage-Supply(Max):75V Temperature Coefficient:- Temperature Coefficient:- Operating Temperature:-55℃~+155℃ Operating Temperature:-55℃~+155℃; LCSC Part Name: 厚膜电阻 0Ω ±1%; Supplier Part: C21189; Manufacturer: UNI-ROYAL(厚声); Supplier Footprint: 0603; JLCPCB Part Class: Basic Part; Datasheet: https://item.szlcsc.com/datasheet/0603WAF0000T5E/21903.html; Supplier: LCSC; Type: Thick Film Resistor; Tolerance: ±1%; Power(Watts): 100mW; Voltage-Supply(Max): 75V; Operating Temperature: -55℃~+155℃
R43 = 0603WAF1003T5E: Type:Thick Film Resistor Resistance:100kΩ Tolerance:±1% Tolerance:±1% Power(Watts):100mW Voltage-Supply(Max):75V Temperature Coefficient:±100ppm/℃ Temperature Coefficient:±100ppm/℃ Operating Temperature:-55℃~+155℃ Operating Temperature:-55℃~+155℃; LCSC Part Name: 厚膜电阻 100kΩ ±1%; Supplier Part: C25803; Manufacturer: UNI-ROYAL(厚声); Supplier Footprint: 0603; JLCPCB Part Class: Basic Part; Datasheet: https://item.szlcsc.com/datasheet/0603WAF1003T5E/26546.html; Supplier: LCSC; Type: Thick Film Resistor; Tolerance: ±1%; Power(Watts): 100mW; Voltage-Supply(Max): 75V; Temperature Coefficient: ±100ppm/℃; Operating Temperature: -55℃~+155℃
RS1 = WSL2512R1000FEA: Type:Current Sensing Resistors Resistance: Tolerance:±1% Tolerance:±1% Rated Output Voltage:- Power(Watts): Rated Current:- Temperature Coefficient:±75ppm/℃ Temperature Coefficient:±75ppm/℃ Mounting Sytle:Surface Mount; LCSC Part Name: 100mΩ ±1% 1W; Supplier Part: C844904; Manufacturer: VISHAY(威世); Supplier Footprint: 2512; JLCPCB Part Class: Extended Part; Datasheet: https://atta.szlcsc.com/upload/public/pdf/source/20210415/C844904_0F03E52552B04FB5D88D289DC8DEDAEB.pdf; Supplier: LCSC; Type: Current Sensing Resistors; Tolerance: ±1%; Temperature Coefficient: ±75ppm/℃; Mounting Sytle: Surface Mount
TP1-TP9 TP15 = 5017: Supplier Part: 5017_C9900015874.1; Supplier Footprint: Testpoint_SMD; JLCPCB Part Class: Extended Part; Supplier: LCSC
U1 = AP63203WU-7: Function:Step-down type Voltage - Supply:3.8V~32V Voltage - Supply:3.8V~32V Output Voltage:3.3V Output Voltage:3.3V Output Current:2A Frequency - Switching:1.1MHz Frequency - Switching:1.1MHz Operating Temperature:-40℃~+85℃@(TA) Operating Temperature:-40℃; LCSC Part Name: 降压型 2A 3.8V~32V; Supplier Part: AP63203WU-7.1; Manufacturer: DIODES(美台); Supplier Footprint: TSOT-23-6; JLCPCB Part Class: Extended Part; Datasheet: https://item.szlcsc.com/datasheet/AP63203WU-7/832852.html; Supplier: LCSC; Function: Step-down type; Voltage - Supply: 3.8V~32V; Output Voltage: 3.3V; Output Current: 2A; Frequency - Switching: 1.1MHz; Operating Temperature: -40℃~+85℃@(TA); Synchronous Rectifier: Yes; Number of Outputs: 1; Topology: Buck; Quiescent Current: 22uA; Switch tube (built-in/external): Built-in; Output Type: Fixed; Features: Light load efficient mode；Cycle-by-cycle current limiting；Overcurrent Protection；EMI optimization (spread spectrum)；Hiccup current limiting
U2 = INA226AIDGSR: Number of Channels:- Vcm - Common Mode Voltage:0V~36V Vcm - Common Mode Voltage:0V~36V Gain:- Bandwidth:- Ib - Input Bias Current:100pA Vos - Input Offset Voltage:2.5uV Operating Temperature:-40℃~+125℃ Operating Temperature:-40℃~+125℃ Differential Voltage; LCSC Part Name: 高侧/低侧测量双向电流/功率监视器，具有I²C兼容接口; Supplier Part: C49851; Manufacturer: TI(德州仪器); Supplier Footprint: VSSOP-10; JLCPCB Part Class: Extended Part; Datasheet: https://www.ti.com/cn/lit/ds/symlink/ina226.pdf; Supplier: LCSC; Vcm - Common Mode Voltage: 0V~36V; Ib - Input Bias Current: 100pA; Vos - Input Offset Voltage: 2.5uV; Operating Temperature: -40℃~+125℃; Differential Voltage: ±40V; Single Supply: 2.7V~5.5V; Quiescent Current: 330uA; Input Offset Voltage Drift(Vos TC): 0.1uV/℃; Common Mode Rejection Ratio (CMRR): 140dB; Features: Programmable threshold alarm；Enable/shutdown function；Bidirectional detection；Digital output interface；High-side detection；Low-side detection；Power monitoring
H1 = HDR-F_2.54_1x8P: Supplier Footprint: Through; Supplier Part: Header-Female-2.54_1x8.1
H2 = HDR-F_2.54_1x8P: Core-S DEV/DUT West socket W1-W8; Supplier Footprint: Through; Supplier Part: Header-Female-2.54_1x8.1
H3 = HDR-F_2.54_1x8P: Core-S DEV/DUT East socket E1-E8; GPIO breakout; Supplier Footprint: Through; Supplier Part: Header-Female-2.54_1x8.1
H4 = HDR-F_2.54_1x8P: Core-S DEV/DUT South socket S1-S8; GPIO breakout; Supplier Footprint: Through; Supplier Part: Header-Female-2.54_1x8.1
H5 = HDR-M_2.54_1x1P: Core-S K-NW corner socket placeholder; final female socket TBD; Supplier Footprint: Through; Supplier Part: HDR_1x1.1
H6 = HDR-M_2.54_1x1P: Core-S K-NE corner socket placeholder; final female socket TBD; Supplier Footprint: Through; Supplier Part: HDR_1x1.1
H7 = HDR-M_2.54_1x1P: Core-S K-SW corner socket placeholder; final female socket TBD; Supplier Footprint: Through; Supplier Part: HDR_1x1.1
JC2 JC3 = 2.54短路帽开口: BOM-only jumper cap; do not place on PCB; LCSC Part Name: 2.54mm Open-Top Jumper Cap; Supplier Part: C5305; Manufacturer: BOOMELE(博穆精密); Supplier Footprint: P=2.54mm; JLCPCB Part Class: Extended Part; Datasheet: https://item.szlcsc.com/datasheet/2.54%25E7%259F%25AD%25E8%25B7%25AF%25E5%25B8%25BD%25E5%25BC%2580%25E5%258F%25A3/5732.html; Supplier: LCSC; Number of Positions or Pins: 1x2; Pitch: 2.54mm; Open Top/Close Top: Open-Top; Current Rating: 3A; colour: Black; Long Handle or Not: Unshrouded
JC10 = 2.54短路帽开口: BOM-only jumper cap; do not place on PCB; LCSC Part Name: 2.54mm Open-Top Jumper Cap; Supplier Part: 2.54短路帽开口.1; Manufacturer: BOOMELE(博穆精密); Supplier Footprint: P=2.54mm; JLCPCB Part Class: Extended Part; Datasheet: https://item.szlcsc.com/datasheet/2.54%25E7%259F%25AD%25E8%25B7%25AF%25E5%25B8%25BD%25E5%25BC%2580%25E5%258F%25A3/5732.html; Supplier: LCSC; Number of Positions or Pins: 1x2; Pitch: 2.54mm; Open Top/Close Top: Open-Top; Current Rating: 3A; colour: Black; Long Handle or Not: Unshrouded
JP3 JP5 JP6 JP11 = PZ254V-11-02P: Pin Structure:1x2P Pitch:2.54mm Row Spacing:- Circluar Pins/Square Pins:Square pin Mounting Type:Through Hole Number of Rows:1 Number of Pins:2P Current Rating:3A Voltage Rating (Max):250V Length of Mating Pin:6.1mm Insulation Height:2.5mm Length of End C; LCSC Part Name: 1x2P 间距:2.54mm 方针 直插; Supplier Part: PZ254V-11-02P.1; Manufacturer: XFCN(兴飞); Supplier Footprint: 插件,P=2.54mm; JLCPCB Part Class: Extended Part; Datasheet: https://item.szlcsc.com/datasheet/PZ254V-11-02P/502957.html; Supplier: LCSC; Pin Structure: 1x2P; Pitch: 2.54mm; Circluar Pins/Square Pins: Square pin; Mounting Type: Through Hole; Number of Rows: 1; Number of Pins: 2P; Current Rating: 3A; Voltage Rating (Max): 250V; Length of Mating Pin: 6.1mm; Insulation Height: 2.5mm; Length of End Connection Pin: 3mm; Contact Material: Brass; Contact Plating: Gold; Operating Temperature: -40℃~+105℃; Color: Black
JP4 = PZ254V-11-03P: Pin Structure:1x3P Pitch:2.54mm Row Spacing:- Circluar Pins/Square Pins:Square pin Mounting Type:Through Hole Number of Rows:1 Number of Pins:3P Current Rating:3A Voltage Rating (Max):250V Length of Mating Pin:6.1mm Insulation Height:2.5mm Length of End C; LCSC Part Name: 1x3P 间距:2.54mm 方针 直插; Supplier Part: PZ254V-11-03P_C2937625.1; Manufacturer: XFCN(兴飞); Supplier Footprint: 插件,P=2.54mm; JLCPCB Part Class: Extended Part; Datasheet: https://item.szlcsc.com/datasheet/PZ254V-11-03P/3293280.html; Supplier: LCSC; Pin Structure: 1x3P; Pitch: 2.54mm; Circluar Pins/Square Pins: Square pin; Mounting Type: Through Hole; Number of Rows: 1; Number of Pins: 3P; Current Rating: 3A; Voltage Rating (Max): 250V; Length of Mating Pin: 6.1mm; Insulation Height: 2.5mm; Length of End Connection Pin: 3mm; Contact Material: Brass; Contact Plating: Gold; Operating Temperature: -40℃~+105℃; Color: Black
LED1 = KT-0805G: DEV/DUT USER LED; active high from N6/PA12; LCSC Part Name: 0805 翠绿 高亮; Supplier Part: C2297; Manufacturer: KENTO; Supplier Footprint: 0805; JLCPCB Part Class: Basic Part; Datasheet: https://item.szlcsc.com/datasheet/KT-0805G/2670.html; Supplier: LCSC; Lamp Holder Type: 2mm x 1.25mm square LED; Illumination Color: Emerald Green; Voltage - Forward(Vf): 2.6V~3.1V; Power(Watts): 100mW; Forward Current: 5mA; Wavelength - Dominant: 513nm~528nm; Peak Wavelength: 525nm; Diode Configuration: Discrete Diode; Lens Color: Water Clear; Luminous Intensity: 430mcd; Viewing Angle: 120°; Operating Temperature: -40℃~+85℃
R12 = 0603WAF0000T5E: SWDIO series configuration resistor, 0 ohm; LCSC Part Name: 厚膜电阻 0Ω ±1%; Supplier Part: 0603WAF0000T5E.1; Manufacturer: UNI-ROYAL(厚声); Supplier Footprint: 0603; JLCPCB Part Class: Basic Part; Datasheet: https://item.szlcsc.com/datasheet/0603WAF0000T5E/21903.html; Supplier: LCSC; Type: Thick Film Resistor; Tolerance: ±1%; Power(Watts): 100mW; Voltage-Supply(Max): 75V; Operating Temperature: -55℃~+155℃
R13 = 0603WAF0000T5E: SWCLK series configuration resistor, 0 ohm; LCSC Part Name: 厚膜电阻 0Ω ±1%; Supplier Part: 0603WAF0000T5E.1; Manufacturer: UNI-ROYAL(厚声); Supplier Footprint: 0603; JLCPCB Part Class: Basic Part; Datasheet: https://item.szlcsc.com/datasheet/0603WAF0000T5E/21903.html; Supplier: LCSC; Type: Thick Film Resistor; Tolerance: ±1%; Power(Watts): 100mW; Voltage-Supply(Max): 75V; Operating Temperature: -55℃~+155℃
R14 = 0402WGF1002TCE: DEV_USER_BTN external pull-up to VDD_TARGET; LCSC Part Name: 厚膜电阻 10kΩ ±1%; Supplier Part: C25744; Manufacturer: UNI-ROYAL(厚声); Supplier Footprint: 0402; JLCPCB Part Class: Basic Part; Datasheet: https://item.szlcsc.com/datasheet/0402WGF1002TCE/26487.html; Supplier: LCSC; Type: Thick Film Resistor; Tolerance: ±1%; Power(Watts): 62.5mW; Voltage-Supply(Max): 50V; Temperature Coefficient: ±100ppm/℃; Operating Temperature: -55℃~+155℃
R15 = 0402WGF1001TCE: DEV_USER_LED current limiting resistor; LCSC Part Name: 厚膜电阻 1kΩ ±1%; Supplier Part: C11702; Manufacturer: UNI-ROYAL(厚声); Supplier Footprint: 0402; JLCPCB Part Class: Basic Part; Datasheet: https://item.szlcsc.com/datasheet/0402WGF1001TCE/12256.html; Supplier: LCSC; Type: Thick Film Resistor; Tolerance: ±1%; Power(Watts): 62.5mW; Voltage-Supply(Max): 50V; Temperature Coefficient: ±100ppm/℃; Operating Temperature: -55℃~+155℃
R16 = 0603WAF0000T5E: VCP UART TX isolation / configuration resistor; LCSC Part Name: 厚膜电阻 0Ω ±1%; Supplier Part: 0603WAF0000T5E.1; Manufacturer: UNI-ROYAL(厚声); Supplier Footprint: 0603; JLCPCB Part Class: Basic Part; Datasheet: https://item.szlcsc.com/datasheet/0603WAF0000T5E/21903.html; Supplier: LCSC; Type: Thick Film Resistor; Tolerance: ±1%; Power(Watts): 100mW; Voltage-Supply(Max): 75V; Operating Temperature: -55℃~+155℃
R17 = 0603WAF0000T5E: VCP UART RX isolation / configuration resistor; LCSC Part Name: 厚膜电阻 0Ω ±1%; Supplier Part: 0603WAF0000T5E.1; Manufacturer: UNI-ROYAL(厚声); Supplier Footprint: 0603; JLCPCB Part Class: Basic Part; Datasheet: https://item.szlcsc.com/datasheet/0603WAF0000T5E/21903.html; Supplier: LCSC; Type: Thick Film Resistor; Tolerance: ±1%; Power(Watts): 100mW; Voltage-Supply(Max): 75V; Operating Temperature: -55℃~+155℃
SW1 = TS6635PA 250gf tactile switch: DEV/DUT reset pushbutton; momentary NO; shorts DEV_NRST to GND when pressed; LCSC Part Name: 6*6/6x6 防水軽触スイッチ; Supplier Part: C55213946; Manufacturer: SHOU HAN(首韓); Supplier Footprint: SMD-4P,6x6mm; JLCPCB Part Class: Extended Part; Datasheet: https://item.szlcsc.com/datasheet/TS6635PA%2520250gf%2520tactile%2520switch/59050570.html; Supplier: LCSC; Circuit: SPST; Actuator Style: Round Button; Operating Force: 2.5N; Mounting Type: Surface Mount,Vertical; Length: 6.4mm; Width: 6.25mm; Switch Height: 3.5mm; with Bracket: Without Bracket; Contact Current: 50mA; Voltage Rating: 12V; Actuator/Cap Color: Blue; With Lamp: No; IP Rating: IP67; Termination Style: Gull Wing; Life: 300,000 cycles; Operating Temperature: -25℃~+70℃
SW2 = TS6635PA 250gf tactile switch: DEV/DUT USER pushbutton; active low; LCSC Part Name: 6*6/6x6 防水轻触开关; Supplier Part: C55213946; Manufacturer: SHOU HAN(首韓); Supplier Footprint: SMD-4P,6x6mm; JLCPCB Part Class: Extended Part; Datasheet: https://item.szlcsc.com/datasheet/TS6635PA%2520250gf%2520tactile%2520switch/59050570.html; Supplier: LCSC; Circuit: SPST; Actuator Style: Round Button; Operating Force: 2.5N; Mounting Type: Surface Mount,Vertical; Length: 6.4mm; Width: 6.25mm; Switch Height: 3.5mm; with Bracket: Without Bracket; Contact Current: 50mA; Voltage Rating: 12V; Actuator/Cap Color: Blue; With Lamp: No; IP Rating: IP67; Termination Style: Gull Wing; Life: 300,000 cycles; Operating Temperature: -25℃~+70℃
U3 = STLINK-V3MODS: LCSC Part Name: 编程器; Supplier Part: STLINK-V3MODS.1; Manufacturer: ST(意法半导体); Supplier Footprint: SMD,30x15mm; JLCPCB Part Class: Extended Part; Datasheet: https://item.szlcsc.com/datasheet/STLINK-V3MODS/2772552.html; Supplier: LCSC
H8-H19 = HDR-F_2.54_1x8P: Unpopulated 2.54 mm GPIO breakout through-hole row; Supplier Footprint: Through; Supplier Part: Header-Female-2.54_1x8.1
H35-H37 = 2.54-1*1P针: Pin Structure:1x1P Pitch:- Row Spacing:- Circluar Pins/Square Pins:Pin Header Mounting Type:Through Hole Number of Rows:1 Number of Pins:1P Current Rating:3A Voltage Rating (Max):- Length of Mating Pin:6mm Insulation Height:2.5mm Length of End Connection; LCSC Part Name: 1x1P 方针 直插; Supplier Part: Header-Male-2.54_1x1.1; Manufacturer: BOOMELE(博穆精密); Supplier Footprint: 插件,P=2.54mm; JLCPCB Part Class: Extended Part; Datasheet: https://item.szlcsc.com/datasheet/2.54-1*1P%25E9%2592%2588/82426.html; Supplier: LCSC; Pin Structure: 1x1P; Circluar Pins/Square Pins: Pin Header; Mounting Type: Through Hole; Number of Rows: 1; Number of Pins: 1P; Current Rating: 3A; Length of Mating Pin: 6mm; Insulation Height: 2.5mm; Length of End Connection Pin: 3mm; Contact Material: Brass; Contact Plating: Gold; Operating Temperature: -55℃~+105℃; Color: Black
H20 = 2.54-1*8P母环保: Core-S CTRL North 1x8 female socket, 2.54 mm pitch; C27438; LCSC Part Name: 1x8P 间距:2.54mm 直插; Supplier Part: Header-Female-2.54_1x8.1; Manufacturer: BOOMELE(博穆精密); Supplier Footprint: 插件,P=2.54mm; JLCPCB Part Class: Extended Part; Datasheet: https://item.szlcsc.com/datasheet/2.54-1*8P%25E6%25AF%258D%25E7%258E%25AF%25E4%25BF%259D/28187.html; Supplier: LCSC; Holes Structure: 1x8P; Pitch: 2.54mm; Circular Hole / Square Hole: Square Hole; Mounting Type: Through Hole; Number of Rows: 1; Number of Positions: 8P; Current Rating: 3A; Holes Direction: Top; Insulation Height: 8.5mm; Contact Material: Brass; Contact Plating: Gold; Operating Temperature: -55℃~+105℃; PIN Length: 3.2mm
H21 = 2.54-1*8P母环保: Core-S CTRL East 1x8 female socket, 2.54 mm pitch; C27438; LCSC Part Name: 1x8P 间距:2.54mm 直插; Supplier Part: Header-Female-2.54_1x8.1; Manufacturer: BOOMELE(博穆精密); Supplier Footprint: 插件,P=2.54mm; JLCPCB Part Class: Extended Part; Datasheet: https://item.szlcsc.com/datasheet/2.54-1*8P%25E6%25AF%258D%25E7%258E%25AF%25E4%25BF%259D/28187.html; Supplier: LCSC; Holes Structure: 1x8P; Pitch: 2.54mm; Circular Hole / Square Hole: Square Hole; Mounting Type: Through Hole; Number of Rows: 1; Number of Positions: 8P; Current Rating: 3A; Holes Direction: Top; Insulation Height: 8.5mm; Contact Material: Brass; Contact Plating: Gold; Operating Temperature: -55℃~+105℃; PIN Length: 3.2mm
H22 = 2.54-1*8P母环保: Core-S CTRL South 1x8 female socket, 2.54 mm pitch; C27438; LCSC Part Name: 1x8P 间距:2.54mm 直插; Supplier Part: Header-Female-2.54_1x8.1; Manufacturer: BOOMELE(博穆精密); Supplier Footprint: 插件,P=2.54mm; JLCPCB Part Class: Extended Part; Datasheet: https://item.szlcsc.com/datasheet/2.54-1*8P%25E6%25AF%258D%25E7%258E%25AF%25E4%25BF%259D/28187.html; Supplier: LCSC; Holes Structure: 1x8P; Pitch: 2.54mm; Circular Hole / Square Hole: Square Hole; Mounting Type: Through Hole; Number of Rows: 1; Number of Positions: 8P; Current Rating: 3A; Holes Direction: Top; Insulation Height: 8.5mm; Contact Material: Brass; Contact Plating: Gold; Operating Temperature: -55℃~+105℃; PIN Length: 3.2mm
H23 = 2.54-1*8P母环保: Core-S CTRL West 1x8 female socket, 2.54 mm pitch; C27438; LCSC Part Name: 1x8P 间距:2.54mm 直插; Supplier Part: Header-Female-2.54_1x8.1; Manufacturer: BOOMELE(博穆精密); Supplier Footprint: 插件,P=2.54mm; JLCPCB Part Class: Extended Part; Datasheet: https://item.szlcsc.com/datasheet/2.54-1*8P%25E6%25AF%258D%25E7%258E%25AF%25E4%25BF%259D/28187.html; Supplier: LCSC; Holes Structure: 1x8P; Pitch: 2.54mm; Circular Hole / Square Hole: Square Hole; Mounting Type: Through Hole; Number of Rows: 1; Number of Positions: 8P; Current Rating: 3A; Holes Direction: Top; Insulation Height: 8.5mm; Contact Material: Brass; Contact Plating: Gold; Operating Temperature: -55℃~+105℃; PIN Length: 3.2mm
H24 = 2.54-1*1P针: Core-S CTRL K-NW single-position 2.54 mm socket land pattern; fit female receptacle at assembly, exact part TBD; LCSC Part Name: 1x1P 方针 直插; Supplier Part: C81276; Manufacturer: BOOMELE(博穆精密); Supplier Footprint: 插件,P=2.54mm; JLCPCB Part Class: Extended Part; Datasheet: https://item.szlcsc.com/datasheet/2.54-1*1P%25E9%2592%2588/82426.html; Supplier: LCSC; Pin Structure: 1x1P; Circluar Pins/Square Pins: Pin Header; Mounting Type: Through Hole; Number of Rows: 1; Number of Pins: 1P; Current Rating: 3A; Length of Mating Pin: 6mm; Insulation Height: 2.5mm; Length of End Connection Pin: 3mm; Contact Material: Brass; Contact Plating: Gold; Operating Temperature: -55℃~+105℃; Color: Black
H25 = 2.54-1*1P针: Core-S CTRL K-NE single-position 2.54 mm socket land pattern; fit female receptacle at assembly, exact part TBD; LCSC Part Name: 1x1P 方针 直插; Supplier Part: C81276; Manufacturer: BOOMELE(博穆精密); Supplier Footprint: 插件,P=2.54mm; JLCPCB Part Class: Extended Part; Datasheet: https://item.szlcsc.com/datasheet/2.54-1*1P%25E9%2592%2588/82426.html; Supplier: LCSC; Pin Structure: 1x1P; Circluar Pins/Square Pins: Pin Header; Mounting Type: Through Hole; Number of Rows: 1; Number of Pins: 1P; Current Rating: 3A; Length of Mating Pin: 6mm; Insulation Height: 2.5mm; Length of End Connection Pin: 3mm; Contact Material: Brass; Contact Plating: Gold; Operating Temperature: -55℃~+105℃; Color: Black
H26 = 2.54-1*1P针: Core-S CTRL K-SW single-position 2.54 mm socket land pattern; fit female receptacle at assembly, exact part TBD; LCSC Part Name: 1x1P 方针 直插; Supplier Part: C81276; Manufacturer: BOOMELE(博穆精密); Supplier Footprint: 插件,P=2.54mm; JLCPCB Part Class: Extended Part; Datasheet: https://item.szlcsc.com/datasheet/2.54-1*1P%25E9%2592%2588/82426.html; Supplier: LCSC; Pin Structure: 1x1P; Circluar Pins/Square Pins: Pin Header; Mounting Type: Through Hole; Number of Rows: 1; Number of Pins: 1P; Current Rating: 3A; Length of Mating Pin: 6mm; Insulation Height: 2.5mm; Length of End Connection Pin: 3mm; Contact Material: Brass; Contact Plating: Gold; Operating Temperature: -55℃~+105℃; Color: Black
TP10-TP14 = 5017: Supplier Part: C9900015874; Supplier Footprint: Testpoint_SMD; JLCPCB Part Class: Extended Part; Supplier: LCSC
H27 = 2.54-1*10P母: Holes Structure:1x10P Pitch:2.54mm Row Spacing:- Circular Hole / Square Hole:Square Hole Mounting Type:Through Hole Number of Rows:1 Number of Positions:10P Current Rating:3A Holes Direction:Top Insulation Height:8.5mm Contact Material:Brass Contact Plati; LCSC Part Name: 1x10P 间距:2.54mm 直插; Supplier Part: C35445; Manufacturer: BOOMELE(博穆精密); Supplier Footprint: 插件,P=2.54mm; JLCPCB Part Class: Extended Part; Datasheet: https://item.szlcsc.com/datasheet/2.54-1*10P%25E6%25AF%258D/36418.html; Supplier: LCSC; Holes Structure: 1x10P; Pitch: 2.54mm; Circular Hole / Square Hole: Square Hole; Mounting Type: Through Hole; Number of Rows: 1; Number of Positions: 10P; Current Rating: 3A; Holes Direction: Top; Insulation Height: 8.5mm; Contact Material: Brass; Contact Plating: Gold; Operating Temperature: -55℃~+105℃; PIN Length: 3.2mm
LED2 = KT-0805G: Lamp Holder Type:2mm x 1.25mm square LED Illumination Color:Emerald Green Voltage - Forward(Vf):2.6V~3.1V Voltage - Forward(Vf):2.6V~3.1V Power(Watts):100mW Forward Current:5mA Wavelength - Dominant:513nm~528nm Wavelength - Dominant:513nm~528nm Peak Wavel; LCSC Part Name: 0805 翠绿 高亮; Supplier Part: C2297; Manufacturer: KENTO; Supplier Footprint: 0805; JLCPCB Part Class: Basic Part; Datasheet: https://item.szlcsc.com/datasheet/KT-0805G/2670.html; Supplier: LCSC; Lamp Holder Type: 2mm x 1.25mm square LED; Illumination Color: Emerald Green; Voltage - Forward(Vf): 2.6V~3.1V; Power(Watts): 100mW; Forward Current: 5mA; Wavelength - Dominant: 513nm~528nm; Peak Wavelength: 525nm; Diode Configuration: Discrete Diode; Lens Color: Water Clear; Luminous Intensity: 430mcd; Viewing Angle: 120°; Operating Temperature: -40℃~+85℃
R19 = 0603WAF1001T5E: Type:Thick Film Resistor Resistance:1kΩ Tolerance:±1% Tolerance:±1% Power(Watts):100mW Voltage-Supply(Max):75V Temperature Coefficient:±100ppm/℃ Temperature Coefficient:±100ppm/℃ Operating Temperature:-55℃~+155℃ Operating Temperature:-55℃~+155℃; LCSC Part Name: 1kΩ ±1% 100mW 厚膜电阻; Supplier Part: C21190; Manufacturer: UNI-ROYAL(厚声); Supplier Footprint: 0603; JLCPCB Part Class: Basic Part; Datasheet: https://item.szlcsc.com/datasheet/0603WAF1001T5E/21904.html; Supplier: LCSC; Type: Thick Film Resistor; Tolerance: ±1%; Power(Watts): 100mW; Voltage-Supply(Max): 75V; Temperature Coefficient: ±100ppm/℃; Operating Temperature: -55℃~+155℃
SW3 = TS6635PA 250gf tactile switch: Circuit:SPST Actuator Style:Round Button Operating Force:2.5N Mounting Type:Surface Mount,Vertical Length:6.4mm Width:6.25mm Switch Height:3.5mm with Bracket:Without Bracket Contact Current:50mA Voltage Rating:12V Actuator/Cap Color:Blue With Lamp:No IP R; LCSC Part Name: 6*6/6x6 防水轻触开关; Supplier Part: C55213946; Manufacturer: SHOU HAN(首韩); Supplier Footprint: SMD-4P,6x6mm; JLCPCB Part Class: Extended Part; Datasheet: https://item.szlcsc.com/datasheet/TS6635PA%2520250gf%2520tactile%2520switch/59050570.html; Supplier: LCSC; Circuit: SPST; Actuator Style: Round Button; Operating Force: 2.5N; Mounting Type: Surface Mount,Vertical; Length: 6.4mm; Width: 6.25mm; Switch Height: 3.5mm; with Bracket: Without Bracket; Contact Current: 50mA; Voltage Rating: 12V; Actuator/Cap Color: Blue; With Lamp: No; IP Rating: IP67; Termination Style: Gull Wing; Life: 300,000 cycles; Operating Temperature: -25℃~+70℃
H28-H31 = 直排针2.54mm 1*8P: Circluar Pins/Square Pins:- Current Rating (Max):- Voltage Rating (Max):- Length of Mating Pin:- Insulation Height:- Contact Material:; LCSC Part Name: 直排针 2.54mm 1*8P; Supplier Part: C49256; Supplier Footprint: 插件; JLCPCB Part Class: Extended Part; Supplier: LCSC
H32-H34 H38 = 2.54-1*1P针: Pin Structure:1x1P Pitch:- Row Spacing:- Circluar Pins/Square Pins:Pin Header Mounting Type:Through Hole Number of Rows:1 Number of Pins:1P Current Rating:3A Voltage Rating (Max):- Length of Mating Pin:6mm Insulation Height:2.5mm Length of End Connection; LCSC Part Name: 1x1P 方针 直插; Supplier Part: C81276; Manufacturer: BOOMELE(博穆精密); Supplier Footprint: 插件,P=2.54mm; JLCPCB Part Class: Extended Part; Datasheet: https://item.szlcsc.com/datasheet/2.54-1*1P%25E9%2592%2588/82426.html; Supplier: LCSC; Pin Structure: 1x1P; Circluar Pins/Square Pins: Pin Header; Mounting Type: Through Hole; Number of Rows: 1; Number of Pins: 1P; Current Rating: 3A; Length of Mating Pin: 6mm; Insulation Height: 2.5mm; Length of End Connection Pin: 3mm; Contact Material: Brass; Contact Plating: Gold; Operating Temperature: -55℃~+105℃; Color: Black

## Nets
GND: C1.2 C2.2 C4.1 C5.2 H5.1 H6.1 H24.1 H25.1 H27.2 H33.1 H34.1 H36.1 H37.1 J1.1 JP4.1 LED2.2(K) R8.1 R9.1 R15.1 R43.1 SW1.2 SW1.4 SW2.2 SW2.4 SW3.2 SW3.4 TP6.1 TP14.1 U1.4(GND) U2.7(GND) U3.5(GNDDETECT) U3.8(GND_2) U3.24(GND) U3.26(GND2) U3.27(GND3) U3.29(GND4) ; also on sheet 7
VDD_CTRL: C2.1 C4.2 C5.1 H26.1 H27.1 H32.1 JP2.2 L1.2 R5.2 R6.2 R7.2 R10.1 R11.1 R18.1 TP3.1 TP13.1 U1.1(FB) U2.6(VS+) ; also on sheet 7
VDD_SHUNT_IN: JP2.1 R3.1 RS1.1 TP4.1
VDD_TARGET: H7.1 H35.1 JP4.3 JP11.2 R4.2 R14.2 RS1.2 TP5.1 U2.8(VBUS)
CTRL_BOOT: H20.4 H28.4
CTRL_CORE_ID: H21.2 H29.2
CTRL_DUT_PWR_EN: H21.1 H29.1
CTRL_E3: H21.3 H29.3
CTRL_E4: H21.4 H29.4
CTRL_N7: H20.7 H28.7
CTRL_N8: H20.8 H28.8
CTRL_NRST: H20.1 H28.1 TP10.1
CTRL_S1: H22.1 H30.1
CTRL_S2: H22.2 H30.2
CTRL_S3: H22.3 H30.3
CTRL_S4: H22.4 H30.4
CTRL_S5: H22.5 H30.5
CTRL_S6: H22.6 H30.6
CTRL_S7: H22.7 H30.7
CTRL_S8: H22.8 H30.8
CTRL_STATUS_LED: H20.6 H28.6 R19.1
CTRL_SWCLK: H20.3 H28.3 TP12.1
CTRL_SWDIO: H20.2 H28.2 TP11.1
CTRL_UART_RX: H23.2 H31.2
CTRL_UART_TX: H23.1 H31.1
CTRL_USER_BTN: H20.5 H28.5 R18.2 SW3.1 SW3.3
CTRL_W8: H23.8 H31.8
DEV_E1: H3.1 H11.1 H12.1 H13.1
DEV_E2: H3.2 H11.2 H12.2 H13.2
DEV_E3: H3.3 H11.3 H12.3 H13.3
DEV_E4: H3.4 H11.4 H12.4 H13.4
DEV_E5: H3.5 H11.5 H12.5 H13.5
DEV_E6: H3.6 H11.6 H12.6 H13.6
DEV_E7: H3.7 H11.7 H12.7 H13.7
DEV_E8: H3.8 H11.8 H12.8 H13.8
DEV_N1: H1.1 H8.1 H9.1 H10.1 JP8.2 SW1.1 SW1.3
DEV_N2: H1.2 H8.2 H9.2 H10.2 ; also on sheet 7
DEV_N3: H1.3 H8.3 H9.3 H10.3 ; also on sheet 7
DEV_N4: H1.4 H8.4 H9.4 H10.4 JP4.2
DEV_N5: H1.5 H8.5 H9.5 H10.5 JP5.1
DEV_N6: H1.6 H8.6 H9.6 H10.6 JP6.1
DEV_N7: H1.7 H8.7 H9.7 H10.7
DEV_N8: H1.8 H8.8 H9.8 H10.8
DEV_S1: H4.1 H14.1 H15.1 H16.1
DEV_S2: H4.2 H14.2 H15.2 H16.2
DEV_S3: H4.3 H14.3 H15.3 H16.3
DEV_S4: H4.4 H14.4 H15.4 H16.4
DEV_S5: H4.5 H14.5 H15.5 H16.5
DEV_S6: H4.6 H14.6 H15.6 H16.6
DEV_S7: H4.7 H14.7 H15.7 H16.7
DEV_S8: H4.8 H14.8 H15.8 H16.8
DEV_USER_BTN: JP5.2 R14.1 SW2.1 SW2.3
DEV_USER_LED: JP6.2 LED1.1(A)
DEV_W1: H2.1 H17.1 H18.1 H19.1 JP9.2
DEV_W2: H2.2 H17.2 H18.2 H19.2 JP10.2
DEV_W3: H2.3 H17.3 H18.3 H19.3
DEV_W4: H2.4 H17.4 H18.4 H19.4
DEV_W5: H2.5 H17.5 H18.5 H19.5
DEV_W6: H2.6 H17.6 H18.6 H19.6
DEV_W7: H2.7 H17.7 H18.7 H19.7
DEV_W8: H2.8 H17.8 H18.8 H19.8
EXT_5V: JP1.5 Q1.2(S)
EXT_5V_RAW: F2.1 J1.2
EXT_RPOL_GATE: Q1.1(G) R43.2
LCD_CS: H21.5 H27.5 H29.5
LCD_DC: H23.6 H27.9 H31.6
LCD_MISO: H21.7 H27.8 H29.7
LCD_MOSI: H21.8 H27.7 H29.8
LCD_RST: H23.7 H27.10 H31.7
LCD_SCK: H21.6 H27.6 H29.6
MEAS_ALERT: H23.5 H31.5 R7.1 TP9.1 U2.3(Alert)
MEAS_SCL: H23.3 H27.3 H31.3 R5.1 TP7.1 U2.5(SCL)
MEAS_SDA: H23.4 H27.4 H31.4 R6.1 TP8.1 U2.4(SDA)
STLINK_5V: JP1.3 TP1.1 U3.22(5V)
STLINK_CLK_MUX: JP3.1 ; also on sheet 7
STLINK_DIO_MUX: R12.2 ; also on sheet 7
STLINK_NRST_RAW: JP8.1 U3.31(T_NRST)
STLINK_SWCLK: R13.1 U3.13(T_JCLK/T_SWCLK)
STLINK_SWDIO: R12.1 U3.4(T_JTMS/T_SWDIO)
STLINK_T_VCC: JP11.1 U3.30(T_VCC)
STLINK_VCP_RX_LINK: JP10.1 R17.2
STLINK_VCP_RX_OUT: R17.1 U3.15(T_VCP_RX)
STLINK_VCP_TX_IN: R16.1 U3.12(T_VCP_TX)
STLINK_VCP_TX_LINK: JP9.1 R16.2
SYS_5V: C1.1 H38.1 JP1.2 JP1.4 JP1.6 TP2.1 U1.2(EN) U1.3(VIN)
USB_C_5V: JP1.1 ; also on sheet 7
$1N52: R8.2 R10.2 U2.1(A1)
$1N53: R9.2 R11.2 U2.2(A0)
$1N72: C3.1 R3.2 U2.10(VIN+)
$1N73: C3.2 R4.1 U2.9(VIN-)
$1N98: F2.2 Q1.3(D)
$1N111: C6.2 L1.1 U1.5(SW)
$1N112: C6.1 U1.6(BST)
$2N6: JP3.2 R13.2
$2N37: LED1.2(K) R15.2
$2N103: TP15.1 U3.6(T_JTDO/T_SWO)
$7N3: LED2.1(A) R19.2

Not connected (* = marked no-connect by the designer): JC1 1(非焊接件)*; JC2 1(非焊接件)*; JC3 1(非焊接件)*; JC4 1(非焊接件)*; JC6 1(非焊接件)*; JC7 1(非焊接件)*; JC8 1(非焊接件)*; JC9 1(非焊接件)*; JC10 1(非焊接件)*; U3 1(BRIDGE_UART_RX)* 2(BRIDGE_UART_CTS)* 3(BRIDGE_UART_RTS)* 7(BRIDGE_SPI_CLK)* 9(BRIDGE_CAN_RX)* 10(BRIDGE_CAN_TX)* 11(BRIDGE_UART_TX)* 14(BRIDGE_SPI_NSS)* 16(BRIDGE_I2C_SCL)* 17(BRIDGE_I2C_SDA)* 18(BRIDGE_GPIO0)* 19(BRIDGE_GPIO1)* 20(BRIDGE_GPIO2)* 21(BRIDGE_GPIO3)* 23(BRIDGE_SPI_MISO)* 25(BRIDGE_SPI_MOSI)* 28(T_JTDI/NC)* 32(T_SW_DIR)*

## Notes on the sheets
sheet 1
- 01_POWER_MEASUREMENT
- POWER BUDGET: total load from STLINK_5V must remain <= 200 mA
- Station-S Rev0: power entry, 3.3 V generation, DUT current/voltage measurement
- TEST POINTS
- 1-2 USB-C   3-4 STLINK (DEFAULT)   5-6 EXT
- POWER INPUT / SELECTION
- J1: optional EXT_5V input; JP1 default jumper 3-4 selects STLINK_5V
- JP1 POWER SOURCE - INSTALL ONE JUMPER ONLY
- Kelvin-route VDD_SHUNT_IN / VDD_TARGET sense traces to R_SHUNT pads
- 3.3 V REGULATOR
- DEV/DUT TARGET POWER & CURRENT SENSE
- REMOVE JP2 BEFORE CONNECTING EXTERNAL AMMETER
- R8/R9 fitted: A1=A0=GND (INA226 address 0x40); R10/R11 DNP
- U2 and CTRL/UI loads use VDD_CTRL and are outside the DUT current path
- INA226 MEASUREMENT PULL-UP
sheet 2
- 02_DEV_DEBUG
- JP3 CLOSE = NORMAL
  JP3 FITTED = SWD ENABLED
- SWD DATA/CLOCK ARE ROUTED THROUGH U10 ON 07_USB_ESP
- JP4 OPEN = NORMAL
sheet 3
- 03_GPIO_BREAKOUT
sheet 4
- 04_CTRL_CORE
- Recovery / fault-analysis test points
- Program the Core-S in DEV/DUT socket, then move it here.
- CTRL Core-S is not connected to STLINK-V3MODS SWD.
- CTRL Core-S socket / measurement and UI control
sheet 5
- 05_CTRL_UI
- STATUS LED (Active High)
- Station control user interface
- Pin 1: VDD_CTRL   2: GND   3: I2C SCL   4: I2C SDA
- Pin 5: CS   6: SCK   7: MOSI   8: MISO   9: DC   10: RST
- LCD connector: I2C or SPI, removable
- STATION USER button (Active Low)
sheet 6
- 06_CTRL_BREAKOUT
- Power / GND access
- SOUTH S1–S8
- WEST W1–W8
- Final size decided during PCB placement
- No default copper or power connection
- 2.54 mm isolated through-hole grid
- PCB ONLY — UNIVERSAL AREA
- NORTH N1–N8
- EAST E1–E8
- CTRL Core-S breakout — one 2.54 mm through-hole per terminal
